# Altium project a0206-2006.PrjPcb (part 2 of 5)

## Sheet a0206-2006.6.SchDoc
size 558 x 431 mm
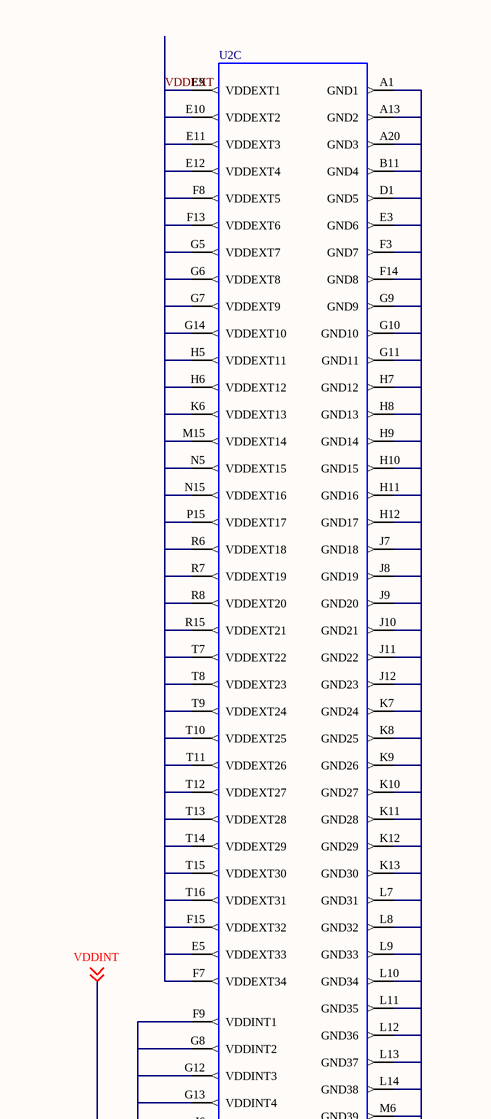
[diagram p15: a0206-2006.6.SchDoc, top left]
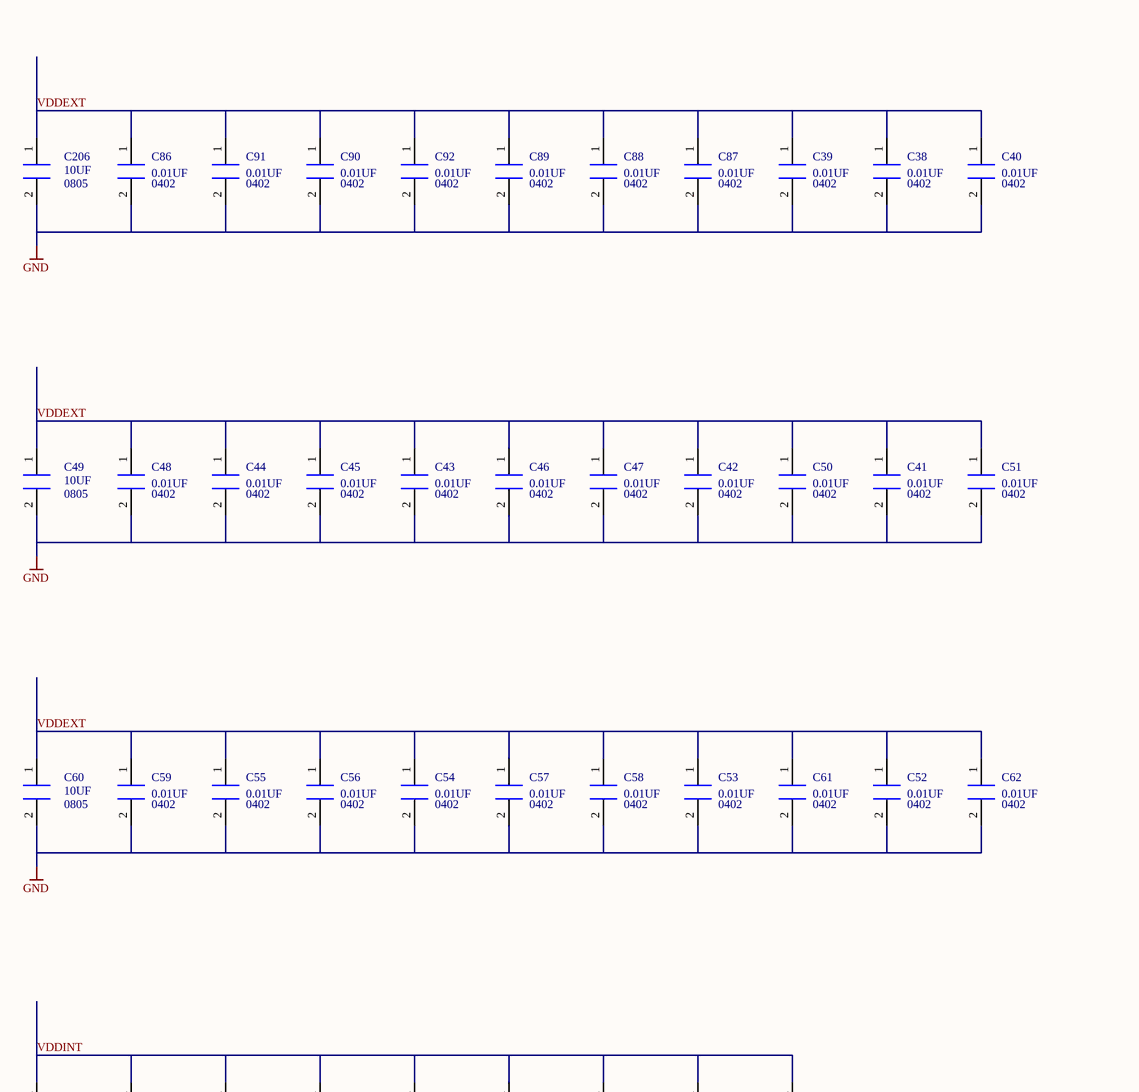
[diagram p16: a0206-2006.6.SchDoc, top right]
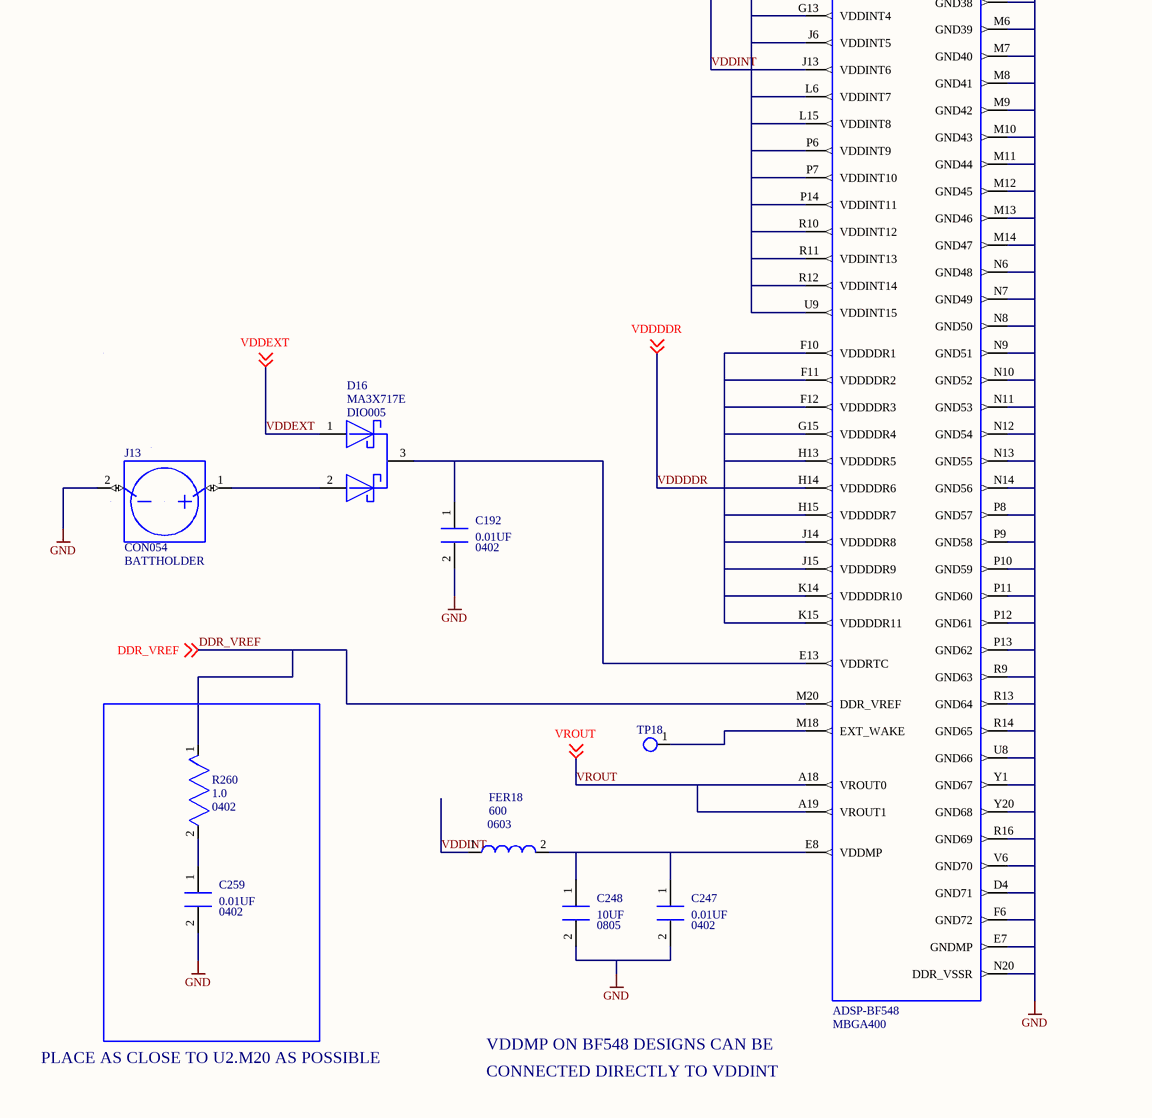
[diagram p17: a0206-2006.6.SchDoc, bottom left]
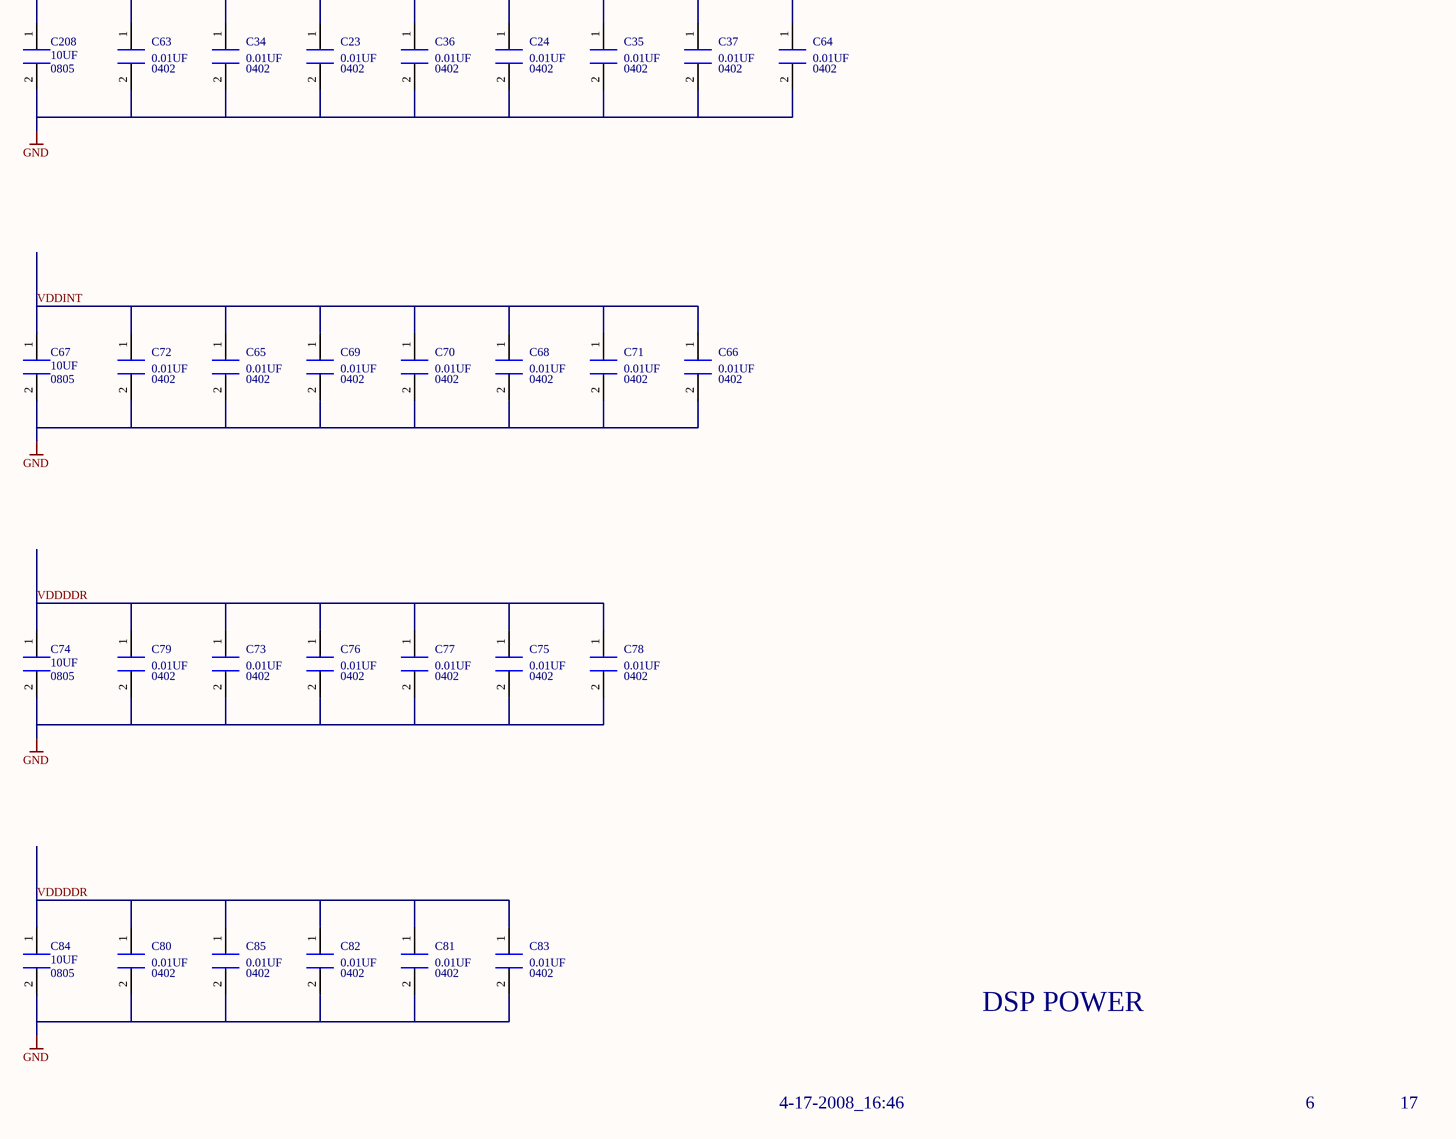
[diagram p18: a0206-2006.6.SchDoc, bottom right]

### Parts
C23  value 0.01UF  [0402]  (hidden comment: *)
C24  value 0.01UF  [0402]  (hidden comment: *)
C34  value 0.01UF  [0402]  (hidden comment: *)
C35  value 0.01UF  [0402]  (hidden comment: *)
C36  value 0.01UF  [0402]  (hidden comment: *)
C37  value 0.01UF  [0402]  (hidden comment: *)
C38  value 0.01UF  [0402]  (hidden comment: *)
C39  value 0.01UF  [0402]  (hidden comment: *)
C40  value 0.01UF  [0402]  (hidden comment: *)
C41  value 0.01UF  [0402]  (hidden comment: *)
C42  value 0.01UF  [0402]  (hidden comment: *)
C43  value 0.01UF  [0402]  (hidden comment: *)
C44  value 0.01UF  [0402]  (hidden comment: *)
C45  value 0.01UF  [0402]  (hidden comment: *)
C46  value 0.01UF  [0402]  (hidden comment: *)
C47  value 0.01UF  [0402]  (hidden comment: *)
C48  value 0.01UF  [0402]  (hidden comment: *)
C49  value 10UF  [0805]  (hidden comment: *)
C50  value 0.01UF  [0402]  (hidden comment: *)
C51  value 0.01UF  [0402]  (hidden comment: *)
C52  value 0.01UF  [0402]  (hidden comment: *)
C53  value 0.01UF  [0402]  (hidden comment: *)
C54  value 0.01UF  [0402]  (hidden comment: *)
C55  value 0.01UF  [0402]  (hidden comment: *)
C56  value 0.01UF  [0402]  (hidden comment: *)
C57  value 0.01UF  [0402]  (hidden comment: *)
C58  value 0.01UF  [0402]  (hidden comment: *)
C59  value 0.01UF  [0402]  (hidden comment: *)
C60  value 10UF  [0805]  (hidden comment: *)
C61  value 0.01UF  [0402]  (hidden comment: *)
C62  value 0.01UF  [0402]  (hidden comment: *)
C63  value 0.01UF  [0402]  (hidden comment: *)
C64  value 0.01UF  [0402]  (hidden comment: *)
C65  value 0.01UF  [0402]  (hidden comment: *)
C66  value 0.01UF  [0402]  (hidden comment: *)
C67  value 10UF  [0805]  (hidden comment: *)
C68  value 0.01UF  [0402]  (hidden comment: *)
C69  value 0.01UF  [0402]  (hidden comment: *)
C70  value 0.01UF  [0402]  (hidden comment: *)
C71  value 0.01UF  [0402]  (hidden comment: *)
C72  value 0.01UF  [0402]  (hidden comment: *)
C73  value 0.01UF  [0402]  (hidden comment: *)
C74  value 10UF  [0805]  (hidden comment: *)
C75  value 0.01UF  [0402]  (hidden comment: *)
C76  value 0.01UF  [0402]  (hidden comment: *)
C77  value 0.01UF  [0402]  (hidden comment: *)
C78  value 0.01UF  [0402]  (hidden comment: *)
C79  value 0.01UF  [0402]  (hidden comment: *)
C80  value 0.01UF  [0402]  (hidden comment: *)
C81  value 0.01UF  [0402]  (hidden comment: *)
C82  value 0.01UF  [0402]  (hidden comment: *)
C83  value 0.01UF  [0402]  (hidden comment: *)
C84  value 10UF  [0805]  (hidden comment: *)
C85  value 0.01UF  [0402]  (hidden comment: *)
C86  value 0.01UF  [0402]  (hidden comment: *)
C87  value 0.01UF  [0402]  (hidden comment: *)
C88  value 0.01UF  [0402]  (hidden comment: *)
C89  value 0.01UF  [0402]  (hidden comment: *)
C90  value 0.01UF  [0402]  (hidden comment: *)
C91  value 0.01UF  [0402]  (hidden comment: *)
C92  value 0.01UF  [0402]  (hidden comment: *)
C192  value 0.01UF  [0402]  (hidden comment: *)
C206  value 10UF  [0805]  (hidden comment: *)
C208  value 10UF  [0805]  (hidden comment: *)
C247  value 0.01UF  [0402]  (hidden comment: *)
C248  value 10UF  [0805]  (hidden comment: *)
C259  value 0.01UF  [0402]  (hidden comment: *)
D16  PART: MA3X717E  [DIO005]  (hidden comment: *)
FER18  value 600  [0603]  (hidden comment: *)
J13  BATTHOLDER  [CON054]
R260  value 1.0  [0402]  (hidden comment: *)
TP18  *  [TP]  (value not drawn)
U2  PART: ADSP-BF548  PKG_TYPE: MBGA400  (hidden comment: ICS_ADSPBF548)  (part C of 7)

### Nets
GND: C23.2(B) C24.2(B) C34.2(B) C35.2(B) C36.2(B) C37.2(B) C38.2(B) C39.2(B) C40.2(B) C41.2(B) C42.2(B) C43.2(B) C44.2(B) C45.2(B) C46.2(B) C47.2(B) C48.2(B) C49.2(B) C50.2(B) C51.2(B) C52.2(B) C53.2(B) C54.2(B) C55.2(B) C56.2(B) C57.2(B) C58.2(B) C59.2(B) C60.2(B) C61.2(B) C62.2(B) C63.2(B) C64.2(B) C65.2(B) C66.2(B) C67.2(B) C68.2(B) C69.2(B) C70.2(B) C71.2(B) C72.2(B) C73.2(B) C74.2(B) C75.2(B) C76.2(B) C77.2(B) C78.2(B) C79.2(B) C80.2(B) C81.2(B) C82.2(B) C83.2(B) C84.2(B) C85.2(B) C86.2(B) C87.2(B) C88.2(B) C89.2(B) C90.2(B) C91.2(B) C92.2(B) C192.2(B) C206.2(B) C208.2(B) C247.2(B) C248.2(B) C259.2(B) J13.2(NEG) U2.A1(GND1) U2.A13(GND2) U2.A20(GND3) U2.B11(GND4) U2.D1(GND5) U2.D4(GND71) U2.E3(GND6) U2.E7(GNDMP) U2.F3(GND7) U2.F6(GND72) U2.F14(GND8) U2.G9(GND9) U2.G10(GND10) U2.G11(GND11) U2.H7(GND12) U2.H8(GND13) U2.H9(GND14) U2.H10(GND15) U2.H11(GND16) U2.H12(GND17) U2.J7(GND18) U2.J8(GND19) U2.J9(GND20) U2.J10(GND21) U2.J11(GND22) U2.J12(GND23) U2.K7(GND24) U2.K8(GND25) U2.K9(GND26) U2.K10(GND27) U2.K11(GND28) U2.K12(GND29) U2.K13(GND30) U2.L7(GND31) U2.L8(GND32) U2.L9(GND33) U2.L10(GND34) U2.L11(GND35) U2.L12(GND36) U2.L13(GND37) U2.L14(GND38) U2.M6(GND39) U2.M7(GND40) U2.M8(GND41) U2.M9(GND42) U2.M10(GND43) U2.M11(GND44) U2.M12(GND45) U2.M13(GND46) U2.M14(GND47) U2.N6(GND48) U2.N7(GND49) U2.N8(GND50) U2.N9(GND51) U2.N10(GND52) U2.N11(GND53) U2.N12(GND54) U2.N13(GND55) U2.N14(GND56) U2.N20(DDR_VSSR) U2.P8(GND57) U2.P9(GND58) U2.P10(GND59) U2.P11(GND60) U2.P12(GND61) U2.P13(GND62) U2.R9(GND63) U2.R13(GND64) U2.R14(GND65) U2.R16(GND69) U2.U8(GND66) U2.V6(GND70) U2.Y1(GND67) U2.Y20(GND68)
DDR_VREF: R260.1(N1) U2.M20(DDR_VREF) ; off-sheet DDR_VREF
VDDDDR: C73.1(A) C74.1(A) C75.1(A) C76.1(A) C77.1(A) C78.1(A) C79.1(A) C80.1(A) C81.1(A) C82.1(A) C83.1(A) C84.1(A) C85.1(A) U2.F10(VDDDDR1) U2.F11(VDDDDR2) U2.F12(VDDDDR3) U2.G15(VDDDDR4) U2.H13(VDDDDR5) U2.H14(VDDDDR6) U2.H15(VDDDDR7) U2.J14(VDDDDR8) U2.J15(VDDDDR9) U2.K14(VDDDDR10) U2.K15(VDDDDR11) ; off-sheet VDDDDR
VDDEXT: C38.1(A) C39.1(A) C40.1(A) C41.1(A) C42.1(A) C43.1(A) C44.1(A) C45.1(A) C46.1(A) C47.1(A) C48.1(A) C49.1(A) C50.1(A) C51.1(A) C52.1(A) C53.1(A) C54.1(A) C55.1(A) C56.1(A) C57.1(A) C58.1(A) C59.1(A) C60.1(A) C61.1(A) C62.1(A) C86.1(A) C87.1(A) C88.1(A) C89.1(A) C90.1(A) C91.1(A) C92.1(A) C206.1(A) D16.1 U2.E5(VDDEXT33) U2.E9(VDDEXT1) U2.E10(VDDEXT2) U2.E11(VDDEXT3) U2.E12(VDDEXT4) U2.F7(VDDEXT34) U2.F8(VDDEXT5) U2.F13(VDDEXT6) U2.F15(VDDEXT32) U2.G5(VDDEXT7) U2.G6(VDDEXT8) U2.G7(VDDEXT9) U2.G14(VDDEXT10) U2.H5(VDDEXT11) U2.H6(VDDEXT12) U2.K6(VDDEXT13) U2.M15(VDDEXT14) U2.N5(VDDEXT15) U2.N15(VDDEXT16) U2.P15(VDDEXT17) U2.R6(VDDEXT18) U2.R7(VDDEXT19) U2.R8(VDDEXT20) U2.R15(VDDEXT21) U2.T7(VDDEXT22) U2.T8(VDDEXT23) U2.T9(VDDEXT24) U2.T10(VDDEXT25) U2.T11(VDDEXT26) U2.T12(VDDEXT27) U2.T13(VDDEXT28) U2.T14(VDDEXT29) U2.T15(VDDEXT30) U2.T16(VDDEXT31) ; off-sheet VDDEXT
VDDINT: C23.1(A) C24.1(A) C34.1(A) C35.1(A) C36.1(A) C37.1(A) C63.1(A) C64.1(A) C65.1(A) C66.1(A) C67.1(A) C68.1(A) C69.1(A) C70.1(A) C71.1(A) C72.1(A) C208.1(A) FER18.1(A) U2.F9(VDDINT1) U2.G8(VDDINT2) U2.G12(VDDINT3) U2.G13(VDDINT4) U2.J6(VDDINT5) U2.J13(VDDINT6) U2.L6(VDDINT7) U2.L15(VDDINT8) U2.P6(VDDINT9) U2.P7(VDDINT10) U2.P14(VDDINT11) U2.R10(VDDINT12) U2.R11(VDDINT13) U2.R12(VDDINT14) U2.U9(VDDINT15) ; off-sheet VDDINT
VROUT: U2.A18(VROUT0) U2.A19(VROUT1) ; off-sheet VROUT
NetC192_1: C192.1(A) D16.3 U2.E13(VDDRTC)
NetC247_1: C247.1(A) C248.1(A) FER18.2(B) U2.E8(VDDMP)
NetC259_1: C259.1(A) R260.2(N2)
NetD16_2: D16.2 J13.1(POS)
NetTP18_1: TP18.1(TP) U2.M18(EXT_WAKE)

### Notes on the sheet
- DSP POWER
- PLACE AS CLOSE TO U2.M20 AS POSSIBLE
- CONNECTED DIRECTLY TO VDDINT
- VDDMP ON BF548 DESIGNS CAN BE
- 4-17-2008_16:46
- 6
- 17
- A
- B
- C
- D
- 1
- 2
- 3
- 20 Cotton Road
- 4
- DEVICES
- ANALOG
- Nashua, NH 03063
- PH: 1-800-ANALOGD
- Title
- ADSP-BF548 EZ-KIT LITE
- Size
- Board No.
- A0206-2006
- Rev
- 1.4B
- Date
- Sheet
- of

### Library data of the parts
C23 C24 C34 C37 C50 C54 C55 C58 C59 C72 C79 C82 C83 C85 C86 C88 C91 C92 C192 C247 = CAP_NON_POLARIZED.2: as C7 on sheet a0206-2006.2; PKG_TYPE: 0402; ROHS: ROHS
C35 C36 C40 C41 C53 C56 C57 C62 C81 C87 C89 C90 = CAP_NON_POLARIZED.2: PART_SPEC: CAPACITOR; LEVEL: STD; TYPE: X7R; BOARDS: BOTH; PRT_NUM: 7000279; VOLTAGE: 16V; TOLERANCE: 10%; PKG_TYPE: 0402; ROHS: ROHS
C38 C42 C45 C46 C51 C52 C70 C71 C77 C78 = CAP_NON_POLARIZED.2: PART_SPEC: CAPACITOR; LEVEL: STD; TOLERANCE: 10%; VOLTAGE: 16V; PRT_NUM: 7000279; BOARDS: BOTH; TYPE: X7R; PKG_TYPE: 0402; ROHS: ROHS
C39 C43 C44 C47 C48 C61 C63-C66 C68 C69 C73 C75 C76 C80 C259 = CAP_NON_POLARIZED.2: as C3 on sheet a0206-2006.2; PKG_TYPE: 0402; ROHS: ROHS
C49 C67 C74 = CAP_NON_POLARIZED.2: PART_SPEC: CAPACITOR; LEVEL: STD; BOARDS: BOTH; TOLERANCE: 10%; VOLTAGE: 6.3V; PRT_NUM: 7000265; TYPE: X5R; PKG_TYPE: 0805; ROHS: ROHS
C60 C84 C206 C208 = CAP_NON_POLARIZED.2: PART_SPEC: CAPACITOR; LEVEL: STD; TYPE: X5R; PRT_NUM: 7000265; VOLTAGE: 6.3V; TOLERANCE: 10%; BOARDS: BOTH; PKG_TYPE: 0805; ROHS: ROHS
C248 = CAP_NON_POLARIZED.2: PART_SPEC: CAPACITOR; LEVEL: STD; PRT_NUM: 7000265; VOLTAGE: 6.3V; TOLERANCE: 10%; BOARDS: BOTH; TYPE: X5R; PKG_TYPE: 0805; ROHS: ROHS
D16 = DIO_MA3X717E.1: SCHOTTKY BARRIER; LEVEL: STD; CURRENT: 20MA; PRT_NUM: 7000559; PKG_TYPE: DIO005; WEB: http://www.semicon.panasonic.co.jp/ds/eng/SKH00078CED.pdf; ROHS: ROHS
FER18 = FER_STANDARD.1: PART_SPEC: FERRITE; LEVEL: STD; PRT_NUM: 7000112; FREQ: 100MHZ; CURRENT: 200MA; PKG_TYPE: 0603; ROHS: ROHS
J13 = CON_BATTERYHOLDER.1: FOR 24MM COIN; LEVEL: STD; PRT_NUM: 6000829; PKG_TYPE: CON054; DEVICE: BATTHOLDER; TYPE: BATT_HOLDER; CONFIGURATION: 24MM; ROHS: ROHS
R260 = RES_STANDARD.2: PART_SPEC: RESISTOR; LEVEL: STD; TOLERANCE: 1%; PRT_NUM: 7000608; POWER: 1/16W; PKG_TYPE: 0402; ROHS: ROHS
TP18 = MSC_TEST_POINT.2: TESTPOINT; CLASS: DNP; LEVEL: STD; PART_SPEC: TESTPOINT; PART: TESTPOINT; ROHS: ROHS; PKG_TYPE: TP
U2 = ICS_ADSPBF548_A: as U2 on sheet a0206-2006.2; DEVICE: ICS_ADSPBF548; ROHS: ROHS; WEB: http://www.analog.com/en/prod/0,2877,ADSP%252DBF548,00.html

## Sheet a0206-2006.7.SchDoc
size 558 x 431 mm
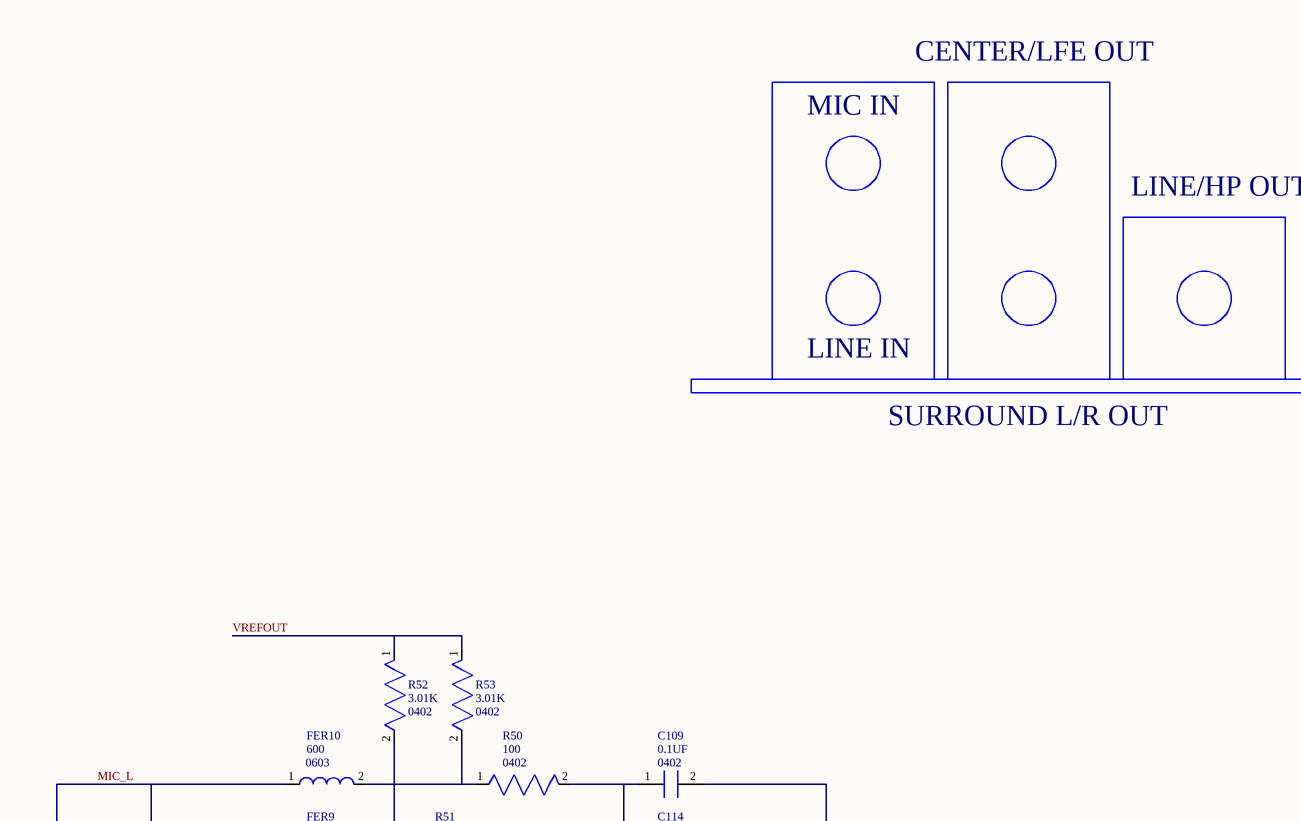
[diagram p19: a0206-2006.7.SchDoc, top left]
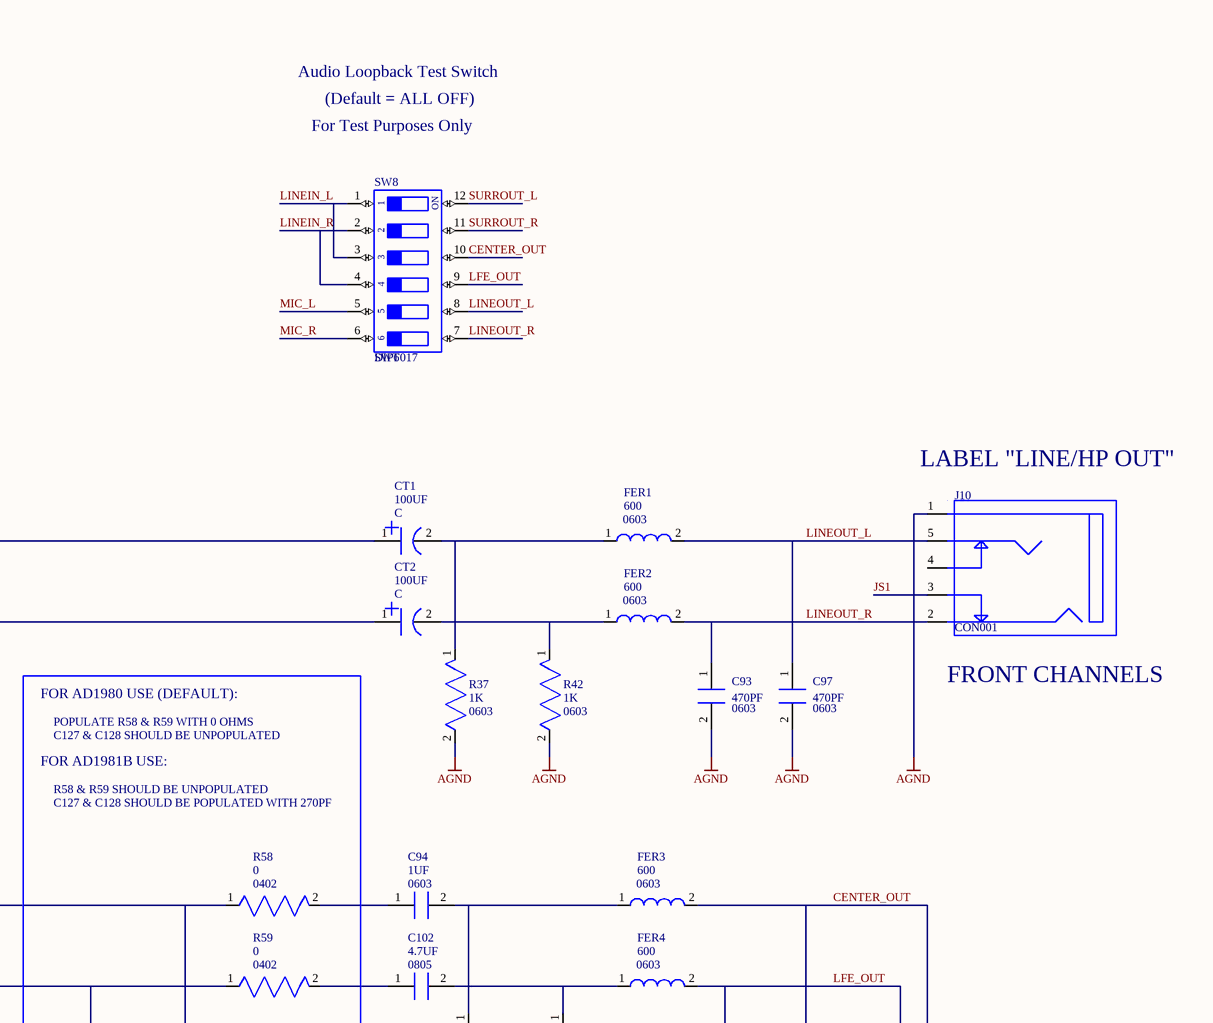
[diagram p20: a0206-2006.7.SchDoc, top right]
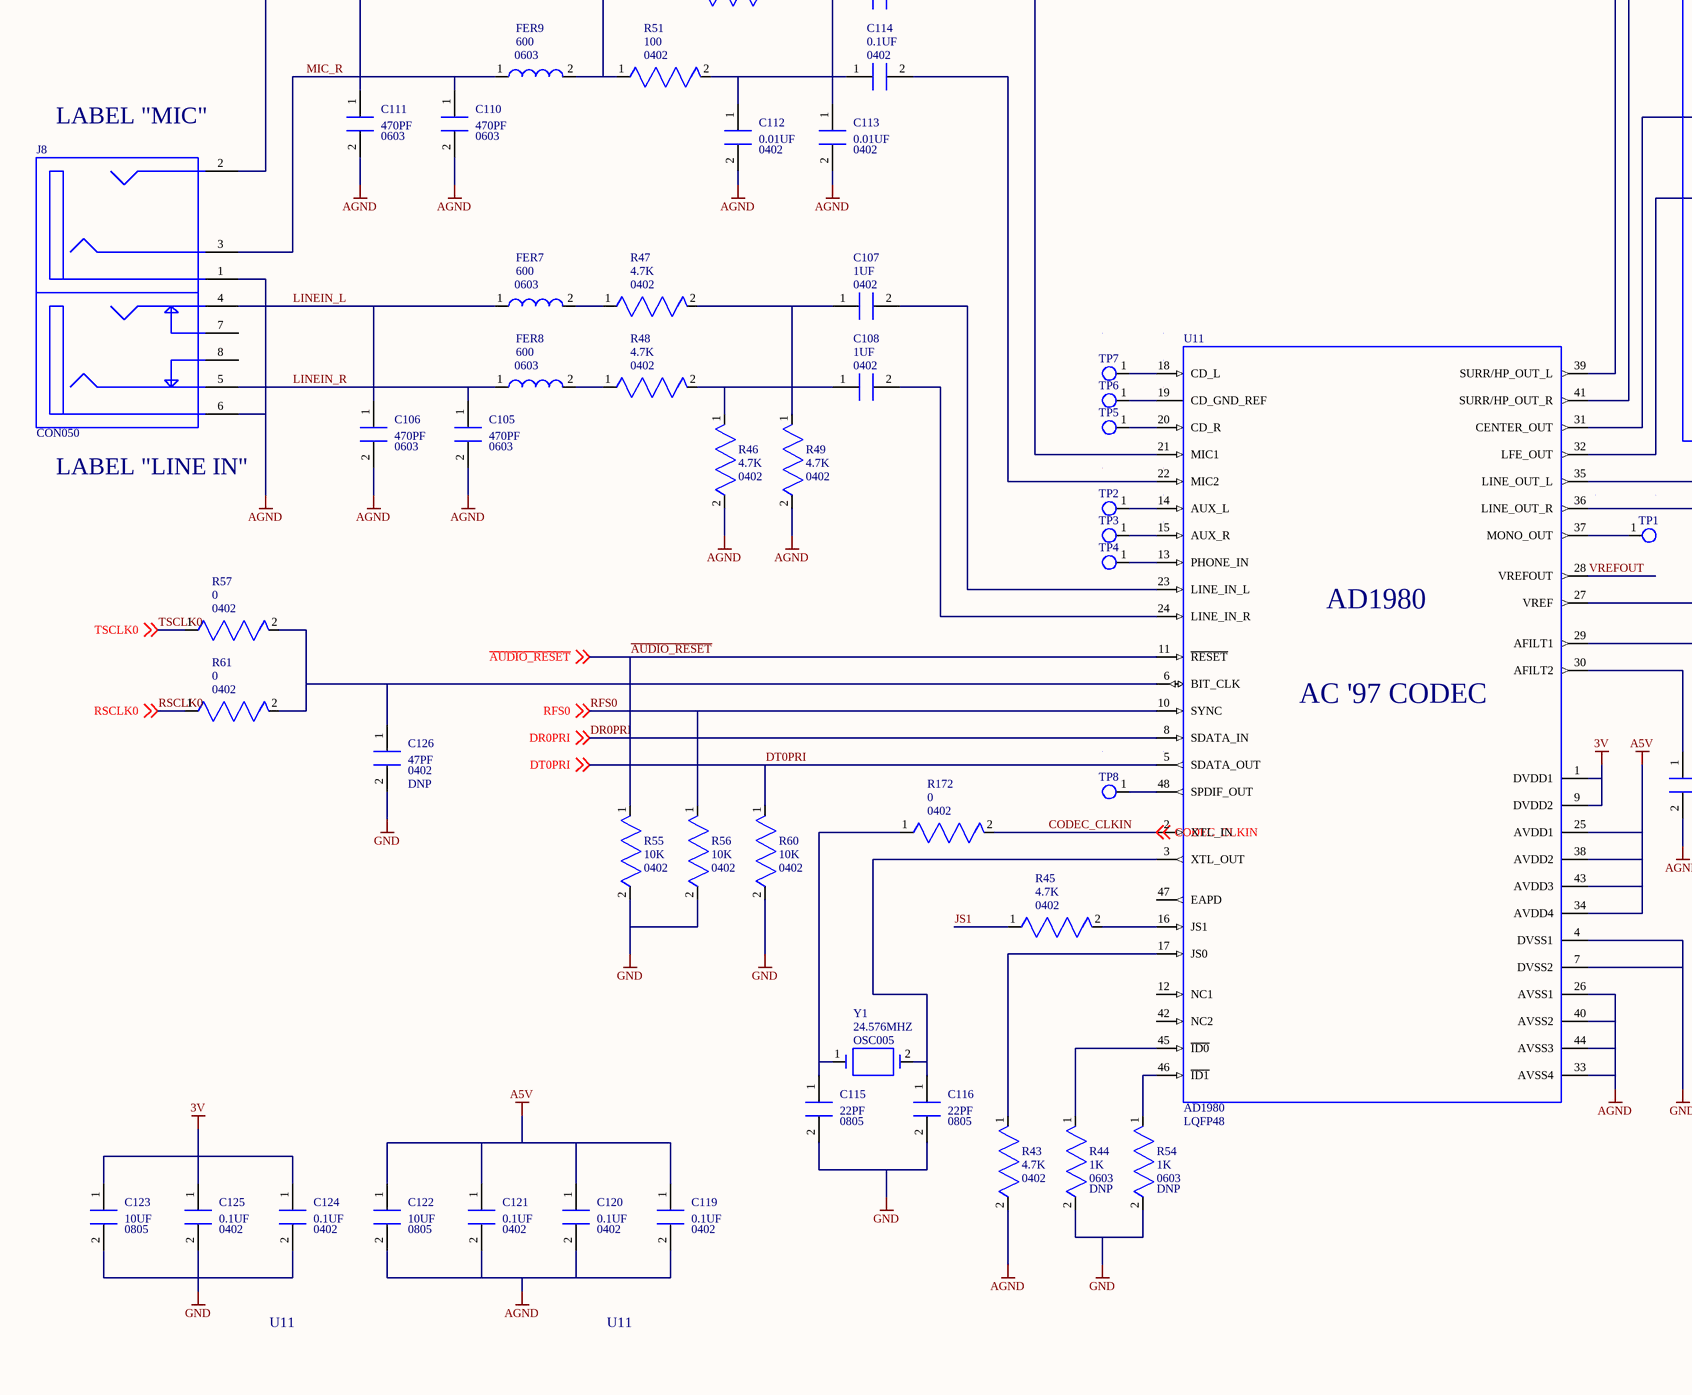
[diagram p21: a0206-2006.7.SchDoc, bottom left]
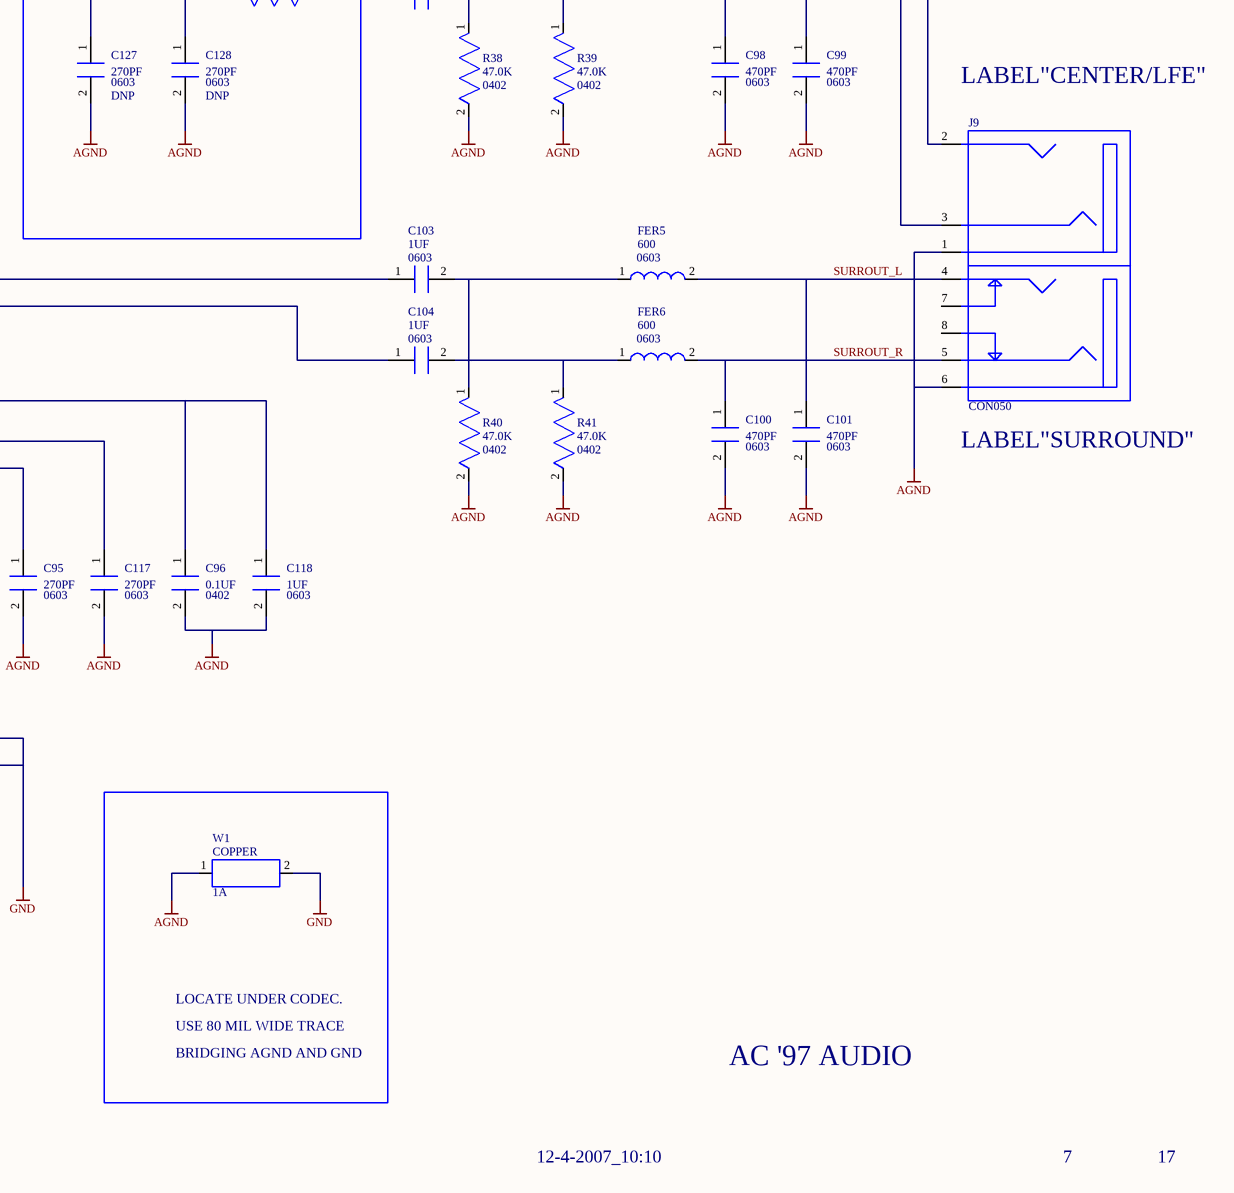
[diagram p22: a0206-2006.7.SchDoc, bottom right]

### Parts
C93  value 470PF  [0603]  (hidden comment: *)
C94  value 1UF  [0603]  (hidden comment: *)
C95  value 270PF  [0603]  (hidden comment: *)
C96  value 0.1UF  [0402]  (hidden comment: *)
C97  value 470PF  [0603]  (hidden comment: *)
C98  value 470PF  [0603]  (hidden comment: *)
C99  value 470PF  [0603]  (hidden comment: *)
C100  value 470PF  [0603]  (hidden comment: *)
C101  value 470PF  [0603]  (hidden comment: *)
C102  value 4.7UF  [0805]  (hidden comment: *)
C103  value 1UF  [0603]  (hidden comment: *)
C104  value 1UF  [0603]  (hidden comment: *)
C105  value 470PF  [0603]  (hidden comment: *)
C106  value 470PF  [0603]  (hidden comment: *)
C107  value 1UF  [0402]  (hidden comment: *)
C108  value 1UF  [0402]  (hidden comment: *)
C109  value 0.1UF  [0402]  (hidden comment: *)
C110  value 470PF  [0603]  (hidden comment: *)
C111  value 470PF  [0603]  (hidden comment: *)
C112  value 0.01UF  [0402]  (hidden comment: *)
C113  value 0.01UF  [0402]  (hidden comment: *)
C114  value 0.1UF  [0402]  (hidden comment: *)
C115  value 22PF  [0805]  (hidden comment: *)
C116  value 22PF  [0805]  (hidden comment: *)
C117  value 270PF  [0603]  (hidden comment: *)
C118  value 1UF  [0603]  (hidden comment: *)
C119  value 0.1UF  [0402]  (hidden comment: *)
C120  value 0.1UF  [0402]  (hidden comment: *)
C121  value 0.1UF  [0402]  (hidden comment: *)
C122  value 10UF  [0805]  (hidden comment: *)
C123  value 10UF  [0805]  (hidden comment: *)
C124  value 0.1UF  [0402]  (hidden comment: *)
C125  value 0.1UF  [0402]  (hidden comment: *)
C126  value 47PF  CLASS: DNP  [0402]  (hidden comment: *)
C127  value 270PF  CLASS: DNP  [0603]  (hidden comment: *)
C128  value 270PF  CLASS: DNP  [0603]  (hidden comment: *)
CT1  value 100UF  [C]  (hidden comment: *)
CT2  value 100UF  [C]  (hidden comment: *)
FER1  value 600  [0603]  (hidden comment: *)
FER2  value 600  [0603]  (hidden comment: *)
FER3  value 600  [0603]  (hidden comment: *)
FER4  value 600  [0603]  (hidden comment: *)
FER5  value 600  [0603]  (hidden comment: *)
FER6  value 600  [0603]  (hidden comment: *)
FER7  value 600  [0603]  (hidden comment: *)
FER8  value 600  [0603]  (hidden comment: *)
FER9  value 600  [0603]  (hidden comment: *)
FER10  value 600  [0603]  (hidden comment: *)
J8  *  [CON050]  (value not drawn)
J9  *  [CON050]  (value not drawn)
J10  *  [CON001]  (value not drawn)
R37  value 1K  [0603]  (hidden comment: *)
R38  value 47.0K  [0402]  (hidden comment: *)
R39  value 47.0K  [0402]  (hidden comment: *)
R40  value 47.0K  [0402]  (hidden comment: *)
R41  value 47.0K  [0402]  (hidden comment: *)
R42  value 1K  [0603]  (hidden comment: *)
R43  value 4.7K  [0402]  (hidden comment: *)
R44  value 1K  CLASS: DNP  [0603]  (hidden comment: *)
R45  value 4.7K  [0402]  (hidden comment: *)
R46  value 4.7K  [0402]  (hidden comment: *)
R47  value 4.7K  [0402]  (hidden comment: *)
R48  value 4.7K  [0402]  (hidden comment: *)
R49  value 4.7K  [0402]  (hidden comment: *)
R50  value 100  [0402]  (hidden comment: *)
R51  value 100  [0402]  (hidden comment: *)
R52  value 3.01K  [0402]  (hidden comment: *)
R53  value 3.01K  [0402]  (hidden comment: *)
R54  value 1K  CLASS: DNP  [0603]  (hidden comment: *)
R55  value 10K  [0402]  (hidden comment: *)
R56  value 10K  [0402]  (hidden comment: *)
R57  value 0  [0402]  (hidden comment: *)
R58  value 0  [0402]  (hidden comment: *)
R59  value 0  [0402]  (hidden comment: *)
R60  value 10K  [0402]  (hidden comment: *)
R61  value 0  [0402]  (hidden comment: *)
R172  value 0  [0402]  (hidden comment: *)
SW8  value DIP6  [SWT017]  (hidden comment: *)
TP1  *  [TP]  (value not drawn)
TP2  *  [TP]  (value not drawn)
TP3  *  [TP]  (value not drawn)
TP4  *  [TP]  (value not drawn)
TP5  *  [TP]  (value not drawn)
TP6  *  [TP]  (value not drawn)
TP7  *  [TP]  (value not drawn)
TP8  *  [TP]  (value not drawn)
U11  PART: AD1980  [LQFP48]  (hidden comment: *)
W1  value COPPER  [1A]  (hidden comment: *)
Y1  value 24.576MHZ  [OSC005]  (hidden comment: *)

### Nets
3V: C123.1(A) C124.1(A) C125.1(A) U11.1(DVDD1) U11.9(DVDD2)
A5V: C119.1(A) C120.1(A) C121.1(A) C122.1(A) U11.25(AVDD1) U11.34(AVDD4) U11.38(AVDD2) U11.43(AVDD3)
AGND: C93.2(B) C95.2(B) C96.2(B) C97.2(B) C98.2(B) C99.2(B) C100.2(B) C101.2(B) C105.2(B) C106.2(B) C110.2(B) C111.2(B) C112.2(B) C113.2(B) C117.2(B) C118.2(B) C119.2(B) C120.2(B) C121.2(B) C122.2(B) C127.2(B) C128.2(B) J8.1 J8.6 J9.1 J9.6 J10.1 R37.2(N2) R38.2(N2) R39.2(N2) R40.2(N2) R41.2(N2) R42.2(N2) R43.2(N2) R46.2(N2) R49.2(N2) U11.26(AVSS1) U11.33(AVSS4) U11.40(AVSS2) U11.44(AVSS3) W1.1(N1)
GND: C115.2(B) C116.2(B) C123.2(B) C124.2(B) C125.2(B) C126.2(B) R44.2(N2) R54.2(N2) R55.2(N2) R56.2(N2) R60.2(N2) U11.4(DVSS1) U11.7(DVSS2) W1.2(N2)
~{AUDIO_RESET}: R55.1(N1) U11.11(~{RESET}) ; off-sheet ~{AUDIO_RESET}
CENTER_OUT: C99.1(A) FER3.2(B) J9.2 SW8.10
CODEC_CLKIN: R172.2(N2) U11.2(XTL_IN) ; off-sheet CODEC_CLKIN
DR0PRI: U11.8(SDATA_IN) ; off-sheet DR0PRI
DT0PRI: R60.1(N1) U11.5(SDATA_OUT) ; off-sheet DT0PRI
JS1: J10.3 R45.1(N1)
LFE_OUT: C98.1(A) FER4.2(B) J9.3 SW8.9
LINEIN_L: C106.1(A) FER7.1(A) J8.4 SW8.1 SW8.3
LINEIN_R: C105.1(A) FER8.1(A) J8.5 SW8.2 SW8.4
LINEOUT_L: C97.1(A) FER1.2(B) J10.5 SW8.8
LINEOUT_R: C93.1(A) FER2.2(B) J10.2 SW8.7
MIC_L: C111.1(A) FER10.1(A) J8.2 SW8.5
MIC_R: C110.1(A) FER9.1(A) J8.3 SW8.6
RFS0: R56.1(N1) U11.10(SYNC) ; off-sheet RFS0
RSCLK0: R61.1(N1) ; off-sheet RSCLK0
SURROUT_L: C101.1(A) FER5.2(B) J9.4 SW8.12
SURROUT_R: C100.1(A) FER6.2(B) J9.5 SW8.11
TSCLK0: R57.1(N1) ; off-sheet TSCLK0
VREFOUT: R52.1(N1) R53.1(N1) U11.28(VREFOUT)
NetC94_1: C94.1(A) R58.2(N2)
NetC94_2: C94.2(B) FER3.1(A) R38.1(N1)
NetC95_1: C95.1(A) U11.30(AFILT2)
NetC96_1: C96.1(A) C118.1(A) U11.27(VREF)
NetC102_1: C102.1(A) R59.2(N2)
NetC102_2: C102.2(B) FER4.1(A) R39.1(N1)
NetC103_1: C103.1(A) U11.35(LINE_OUT_L)
NetC103_2: C103.2(B) FER5.1(A) R40.1(N1)
NetC104_1: C104.1(A) U11.36(LINE_OUT_R)
NetC104_2: C104.2(B) FER6.1(A) R41.1(N1)
NetC107_1: C107.1(A) R47.2(N2) R49.1(N1)
NetC107_2: C107.2(B) U11.23(LINE_IN_L)
NetC108_1: C108.1(A) R46.1(N1) R48.2(N2)
NetC108_2: C108.2(B) U11.24(LINE_IN_R)
NetC109_1: C109.1(A) C113.1(A) R50.2(N2)
NetC109_2: C109.2(B) U11.21(MIC1)
NetC112_1: C112.1(A) C114.1(A) R51.2(N2)
NetC114_2: C114.2(B) U11.22(MIC2)
NetC115_1: C115.1(A) R172.1(N1) Y1.1(N1)
NetC116_1: C116.1(A) U11.3(XTL_OUT) Y1.2(N2)
NetC117_1: C117.1(A) U11.29(AFILT1)
NetC126_1: C126.1(A) R57.2(N2) R61.2(N2) U11.6(BIT_CLK)
NetC127_1: C127.1(A) R59.1(N1) U11.32(LFE_OUT)
NetC128_1: C128.1(A) R58.1(N1) U11.31(CENTER_OUT)
NetCT1_1: CT1.1(P) U11.39(SURR/HP_OUT_L)
NetCT1_2: CT1.2(N) FER1.1(A) R37.1(N1)
NetCT2_1: CT2.1(P) U11.41(SURR/HP_OUT_R)
NetCT2_2: CT2.2(N) FER2.1(A) R42.1(N1)
NetFER7_2: FER7.2(B) R47.1(N1)
NetFER8_2: FER8.2(B) R48.1(N1)
NetFER9_2: FER9.2(B) R51.1(N1) R52.2(N2)
NetFER10_2: FER10.2(B) R50.1(N1) R53.2(N2)
NetR43_1: R43.1(N1) U11.17(JS0)
NetR44_1: R44.1(N1) U11.45(~{ID0})
NetR45_2: R45.2(N2) U11.16(JS1)
NetR54_1: R54.1(N1) U11.46(~{ID1})
NetTP1_1: TP1.1(TP) U11.37(MONO_OUT)
NetTP2_1: TP2.1(TP) U11.14(AUX_L)
NetTP3_1: TP3.1(TP) U11.15(AUX_R)
NetTP4_1: TP4.1(TP) U11.13(PHONE_IN)
NetTP5_1: TP5.1(TP) U11.20(CD_R)
NetTP6_1: TP6.1(TP) U11.19(CD_GND_REF)
NetTP7_1: TP7.1(TP) U11.18(CD_L)
NetTP8_1: TP8.1(TP) U11.48(SPDIF_OUT)

Not connected (* = marked no-connect by the designer): J8 7 8; J9 7 8; J10 4; U11 12(NC1) 42(NC2) 47(EAPD)

### Notes on the sheet
- CENTER/LFE OUT
- Audio Loopback Test Switch
- MIC IN
- For Test Purposes Only
- (Default = ALL OFF)
- LINE/HP OUT
- LINE IN
- SURROUND L/R OUT
- (near J10) LABEL "LINE/HP OUT"
- (near J10) FRONT CHANNELS
- FOR AD1980 USE (DEFAULT):
- POPULATE R58 & R59 WITH 0 OHMS
- C127 & C128 SHOULD BE UNPOPULATED
- FOR AD1981B USE:
- R58 & R59 SHOULD BE UNPOPULATED
- C127 & C128 SHOULD BE POPULATED WITH 270PF
- (near J8) LABEL "MIC"
- LABEL"CENTER/LFE"
- (near J8) LABEL "LINE IN"
- (near J9) LABEL"SURROUND"
- LOCATE UNDER CODEC.
- USE 80 MIL WIDE TRACE
- BRIDGING AGND AND GND
- AC '97 AUDIO
- U11
- 12-4-2007_10:10
- 7
- 17
- A
- B
- C
- D
- 1
- 2
- 3
- 20 Cotton Road
- 4
- DEVICES
- ANALOG
- Nashua, NH 03063
- PH: 1-800-ANALOGD
- Title
- ADSP-BF548 EZ-KIT LITE
- Size
- Board No.
- A0206-2006
- Rev
- 1.4B
- Date
- Sheet
- of
- (in symbol ICS_AD1980.1) AC '97 CODEC
- (in symbol SW_DIP6.1) ON

### Library data of the parts
C93 C99 C101 C106 C110 = CAP_NON_POLARIZED.2: PART_SPEC: CAPACITOR; LEVEL: STD; PRT_NUM: 7000352; TYPE: NPO; VOLTAGE: 50V; TOLERANCE: 5%; PKG_TYPE: 0603; ROHS: ROHS
C94 C103 = CAP_NON_POLARIZED.1: PART_SPEC: CAPACITOR; LEVEL: STD; PRT_NUM: 7000344; TYPE: X5R; VOLTAGE: 16V; TOLERANCE: 10%; PKG_TYPE: 0603; ROHS: ROHS
C95 C128 = CAP_NON_POLARIZED.2: PART_SPEC: CAPACITOR; LEVEL: STD; PRT_NUM: 7000419; TYPE: CERM; VOLTAGE: 50V; TOLERANCE: 5%; PKG_TYPE: 0603; ROHS: ROHS
C96 C120 = CAP_NON_POLARIZED.2: PART_SPEC: CAPACITOR; LEVEL: STD; PRT_NUM: 7000278; TYPE: X5R; VOLTAGE: 10V; TOLERANCE: 10%; PKG_TYPE: 0402; ROHS: ROHS
C97 C98 C100 C105 C111 = CAP_NON_POLARIZED.2: PART_SPEC: CAPACITOR; LEVEL: STD; TOLERANCE: 5%; VOLTAGE: 50V; TYPE: NPO; PRT_NUM: 7000352; PKG_TYPE: 0603; ROHS: ROHS
C102 = CAP_NON_POLARIZED.1: PART_SPEC: CAPACITOR; LEVEL: STD; TOLERANCE: 20%; VOLTAGE: 25V; TYPE: X5R; PRT_NUM: 7000347; PKG_TYPE: 0805; ROHS: ROHS
C104 = CAP_NON_POLARIZED.1: PART_SPEC: CAPACITOR; LEVEL: STD; TOLERANCE: 10%; VOLTAGE: 16V; TYPE: X5R; PRT_NUM: 7000344; PKG_TYPE: 0603; ROHS: ROHS
C107 = CAP_NON_POLARIZED.1: PART_SPEC: CAPACITOR; LEVEL: STD; TOLERANCE: 20%; VOLTAGE: 6.3V; TYPE: X7R; PRT_NUM: 7000431; PKG_TYPE: 0402; ROHS: ROHS
C108 = CAP_NON_POLARIZED.1: PART_SPEC: CAPACITOR; LEVEL: STD; PRT_NUM: 7000431; TYPE: X7R; VOLTAGE: 6.3V; TOLERANCE: 20%; PKG_TYPE: 0402; ROHS: ROHS
C109 = CAP_NON_POLARIZED.1: PART_SPEC: CAPACITOR; LEVEL: STD; PRT_NUM: 7000278; TYPE: X5R; VOLTAGE: 10V; TOLERANCE: 10%; PKG_TYPE: 0402; ROHS: ROHS
C112 = CAP_NON_POLARIZED.2: PART_SPEC: CAPACITOR; LEVEL: STD; TOLERANCE: 10%; VOLTAGE: 16V; TYPE: X7R; PRT_NUM: 7000279; PKG_TYPE: 0402; ROHS: ROHS
C113 = CAP_NON_POLARIZED.2: PART_SPEC: CAPACITOR; LEVEL: STD; PRT_NUM: 7000279; TYPE: X7R; VOLTAGE: 16V; TOLERANCE: 10%; PKG_TYPE: 0402; ROHS: ROHS
C114 = CAP_NON_POLARIZED.1: PART_SPEC: CAPACITOR; LEVEL: STD; TOLERANCE: 10%; VOLTAGE: 10V; TYPE: X5R; PRT_NUM: 7000278; PKG_TYPE: 0402; ROHS: ROHS
C115 = CAP_NON_POLARIZED.2: PART_SPEC: CAPACITOR; LEVEL: STD; PRT_NUM: 7000028; TYPE: NPO; VOLTAGE: 50V; TOLERANCE: 5%; PKG_TYPE: 0805; ROHS: ROHS
C116 = CAP_NON_POLARIZED.2: PART_SPEC: CAPACITOR; LEVEL: STD; TOLERANCE: 5%; VOLTAGE: 50V; TYPE: NPO; PRT_NUM: 7000028; PKG_TYPE: 0805; ROHS: ROHS
C117 C127 = CAP_NON_POLARIZED.2: PART_SPEC: CAPACITOR; LEVEL: STD; TOLERANCE: 5%; VOLTAGE: 50V; TYPE: CERM; PRT_NUM: 7000419; PKG_TYPE: 0603; ROHS: ROHS
C118 = CAP_NON_POLARIZED.2: PART_SPEC: CAPACITOR; LEVEL: STD; TOLERANCE: 10%; VOLTAGE: 16V; TYPE: X5R; PRT_NUM: 7000344; PKG_TYPE: 0603; ROHS: ROHS
C119 C121 C124 C125 = CAP_NON_POLARIZED.2: PART_SPEC: CAPACITOR; LEVEL: STD; TOLERANCE: 10%; VOLTAGE: 10V; TYPE: X5R; PRT_NUM: 7000278; PKG_TYPE: 0402; ROHS: ROHS
C122 C123 = CAP_NON_POLARIZED.2: PART_SPEC: CAPACITOR; LEVEL: STD; PRT_NUM: 7000265; TYPE: X5R; VOLTAGE: 6.3V; TOLERANCE: 10%; PKG_TYPE: 0805; ROHS: ROHS
C126 = CAP_NON_POLARIZED.2: PART_SPEC: CAPACITOR; LEVEL: STD; TOLERANCE: 10%; VOLTAGE: 10V; TYPE: X5R; PKG_TYPE: 0402; ROHS: ROHS
CT1 CT2 = CAP_POLARIZED.1: PART_SPEC: CAPACITOR; LEVEL: STD; PRT_NUM: 7000303; VOLTAGE: 10V; TOLERANCE: 10%; PKG_TYPE: C; TYPE: TANT-LOW-ESR; ROHS: ROHS
FER1 FER3 FER5 FER8 FER10 = FER_STANDARD.1: PART_SPEC: FERRITE; LEVEL: STD; PRT_NUM: 7000112; FREQ: 100MHZ; CURRENT: 200MA; PKG_TYPE: 0603; ROHS: ROHS
FER2 FER4 FER6 FER7 FER9 = FER_STANDARD.1: PART_SPEC: FERRITE; LEVEL: STD; CURRENT: 200MA; FREQ: 100MHZ; PRT_NUM: 7000112; PKG_TYPE: 0603; ROHS: ROHS
J8 = CON_STEREOJACK_DUAL.2: AUDIO; PART_SPEC: CONNECTOR; LEVEL: STD; PRT_NUM: 6000825; CONFIGURATION: DUAL_STEREO; PKG_TYPE: CON050; TYPE: 3.5MM; ROHS: ROHS
J9 = CON_STEREOJACK_DUAL.1: AUDIO; PART_SPEC: CONNECTOR; LEVEL: STD; PRT_NUM: 6000825; CONFIGURATION: DUAL_STEREO; PKG_TYPE: CON050; TYPE: 3.5MM; ROHS: ROHS
J10 = CON_STEREOJACK.3: REPLACES ST-323-5; PART_SPEC: CONNECTOR; LEVEL: STD; PRT_NUM: 6000798; CONFIGURATION: STEREO_JACK; PKG_TYPE: CON001; TYPE: 3.5MM; ROHS: ROHS
R37 R44 = RES_STANDARD.2: PART_SPEC: RESISTOR; LEVEL: STD; PRT_NUM: 7000384; POWER: 1/10W; TOLERANCE: 5%; PKG_TYPE: 0603; ROHS: ROHS
R38-R41 = RES_STANDARD.2: PART_SPEC: RESISTOR; LEVEL: STD; PRT_NUM: 7000567; POWER: 1/16W; TOLERANCE: 1%; PKG_TYPE: 0402; ROHS: ROHS
R42 R54 = RES_STANDARD.2: PART_SPEC: RESISTOR; LEVEL: STD; TOLERANCE: 5%; POWER: 1/10W; PRT_NUM: 7000384; PKG_TYPE: 0603; ROHS: ROHS
R43 R49 = RES_STANDARD.2: PART_SPEC: RESISTOR; LEVEL: STD; TOLERANCE: 5%; POWER: 1/16W; PRT_NUM: 7000281; PKG_TYPE: 0402; ROHS: ROHS
R45 R47 = RES_STANDARD.1: PART_SPEC: RESISTOR; LEVEL: STD; PRT_NUM: 7000281; POWER: 1/16W; TOLERANCE: 5%; PKG_TYPE: 0402; ROHS: ROHS
R46 = RES_STANDARD.2: PART_SPEC: RESISTOR; LEVEL: STD; PRT_NUM: 7000281; POWER: 1/16W; TOLERANCE: 5%; PKG_TYPE: 0402; ROHS: ROHS
R48 = RES_STANDARD.1: PART_SPEC: RESISTOR; LEVEL: STD; TOLERANCE: 5%; POWER: 1/16W; PRT_NUM: 7000281; PKG_TYPE: 0402; ROHS: ROHS
R50 = RES_STANDARD.1: PART_SPEC: RESISTOR; LEVEL: STD; TOLERANCE: 5%; POWER: 1/16W; PRT_NUM: 7000432; PKG_TYPE: 0402; ROHS: ROHS
R51 = RES_STANDARD.1: PART_SPEC: RESISTOR; LEVEL: STD; PRT_NUM: 7000432; POWER: 1/16W; TOLERANCE: 5%; PKG_TYPE: 0402; ROHS: ROHS
R52 = RES_STANDARD.2: PART_SPEC: RESISTOR; LEVEL: STD; PRT_NUM: 7000568; POWER: 1/16W; TOLERANCE: 1%; PKG_TYPE: 0402; ROHS: ROHS
R53 = RES_STANDARD.2: PART_SPEC: RESISTOR; LEVEL: STD; TOLERANCE: 1%; POWER: 1/16W; PRT_NUM: 7000568; PKG_TYPE: 0402; ROHS: ROHS
R55 R60 = RES_STANDARD.2: PART_SPEC: RESISTOR; LEVEL: STD; TOLERANCE: 5%; POWER: 1/16W; PRT_NUM: 7000280; PKG_TYPE: 0402; ROHS: ROHS
R56 = RES_STANDARD.2: PART_SPEC: RESISTOR; LEVEL: STD; PRT_NUM: 7000280; POWER: 1/16W; TOLERANCE: 5%; PKG_TYPE: 0402; ROHS: ROHS
R57 = RES_STANDARD.1: PART_SPEC: RESISTOR; LEVEL: STD; PRT_NUM: 7000282; TOLERANCE: 5%; POWER: 1/16W; PKG_TYPE: 0402; ROHS: ROHS
R58 R61 R172 = RES_STANDARD.1: PART_SPEC: RESISTOR; LEVEL: STD; PRT_NUM: 7000282; POWER: 1/16W; TOLERANCE: 5%; PKG_TYPE: 0402; ROHS: ROHS
R59 = RES_STANDARD.1: PART_SPEC: RESISTOR; LEVEL: STD; TOLERANCE: 5%; POWER: 1/16W; PRT_NUM: 7000282; PKG_TYPE: 0402; ROHS: ROHS
SW8 = SW_DIP6.1: PART_SPEC: SWITCH; LEVEL: STD; PRT_NUM: 6000131; PKG_TYPE: SWT017; ROHS: ROHS
TP1-TP8 = MSC_TEST_POINT.2: TESTPOINT; CLASS: DNP; LEVEL: STD; PART_SPEC: TESTPOINT; PART: TESTPOINT; ROHS: ROHS; PKG_TYPE: TP
U11 = ICS_AD1980.1: AC’97 CODEC; LEVEL: STD; PRT_NUM: 30-025762-01; PKG_TYPE: LQFP48; WEB: http://www.analog.com/en/prod/0%2C2877%2CAD1980%2C00.html; ROHS: ROHS
W1 = MSC_COPPER.1: LEVEL: STD; CLASS: DNP; PKG_TYPE: 1A
Y1 = OSC_CRYSTAL.1: CRYSTAL; LEVEL: STD; PRT_NUM: 1000118; PART_SPEC: CRYSTAL; PKG_TYPE: OSC005; ROHS: ROHS

## Sheet a0206-2006.8.SchDoc
size 558 x 431 mm
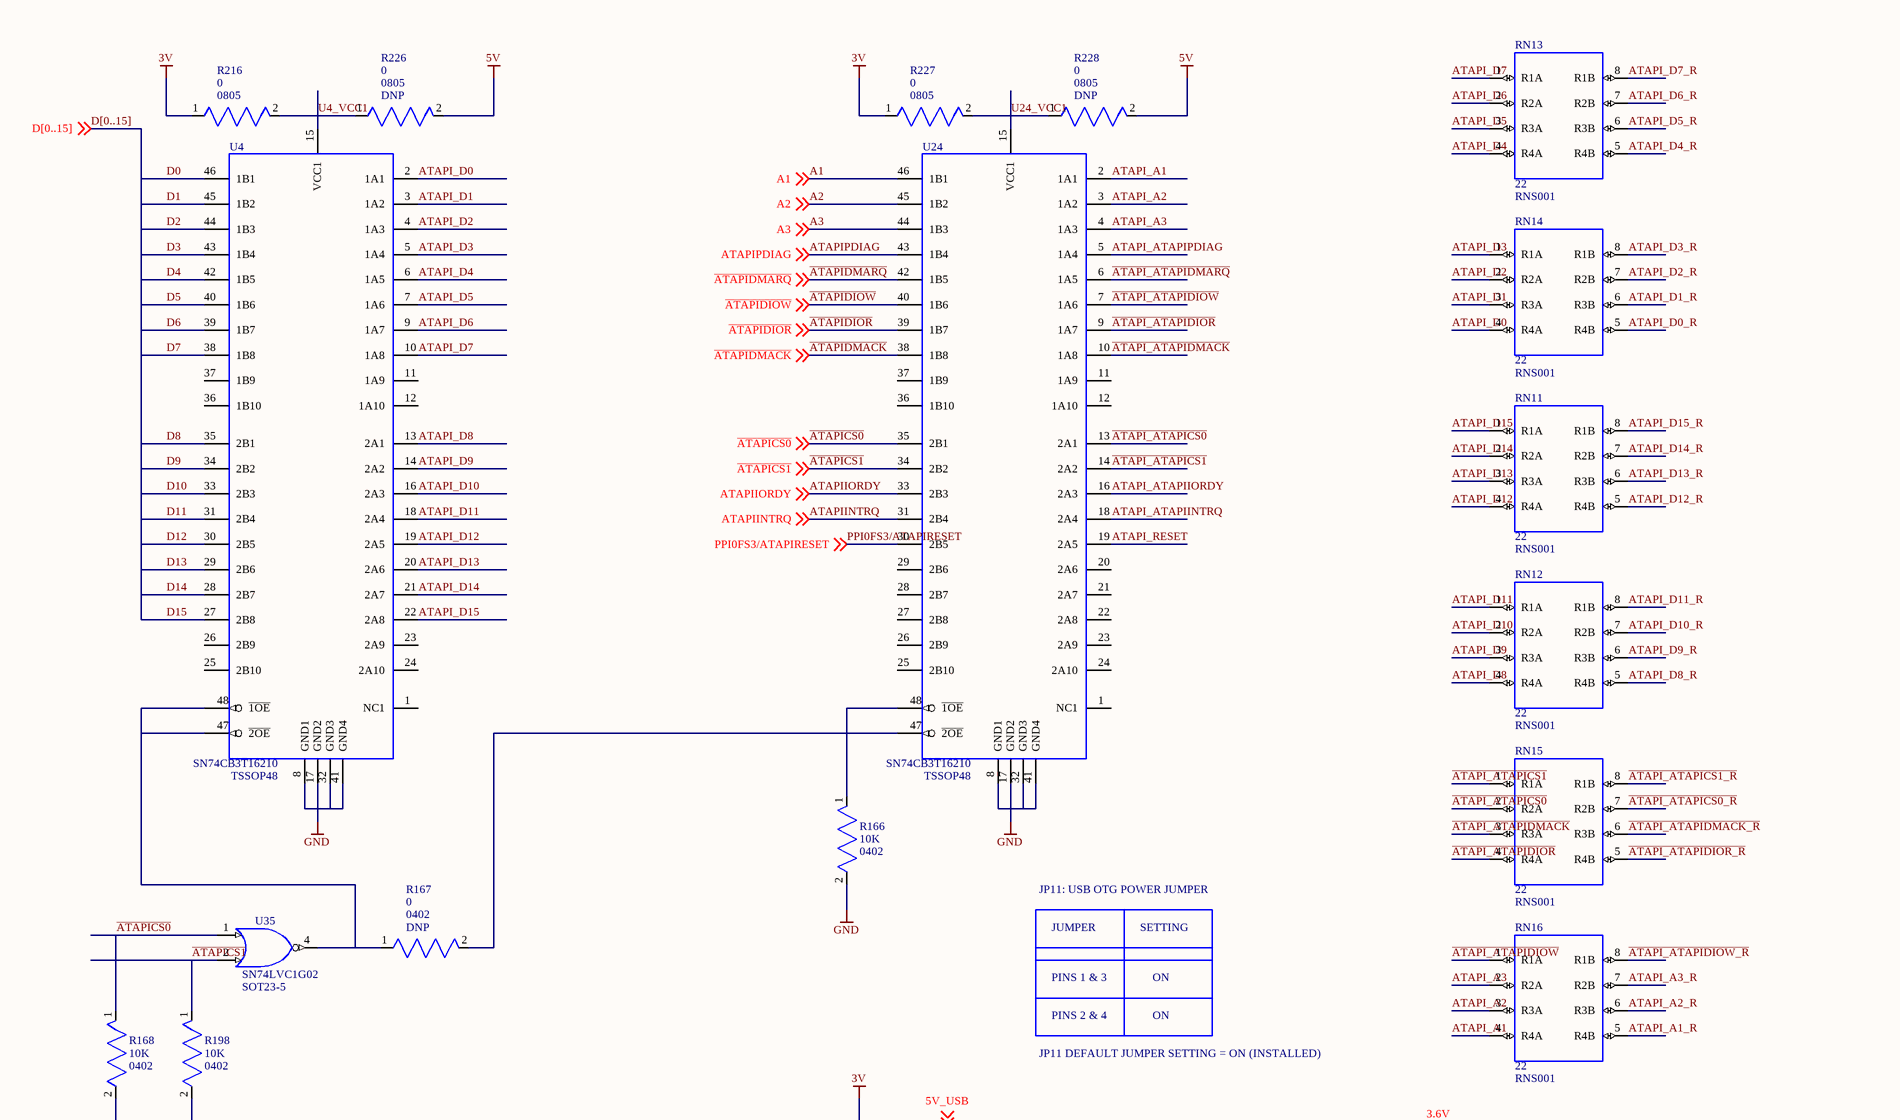
[diagram p23: a0206-2006.8.SchDoc, top left]
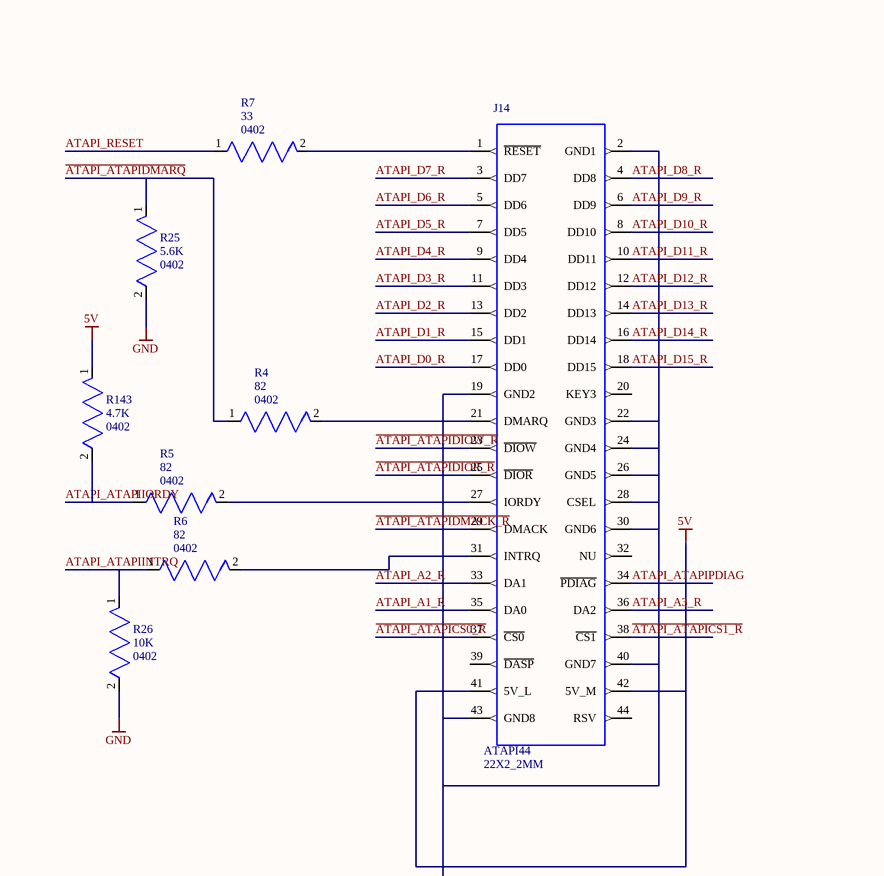
[diagram p24: a0206-2006.8.SchDoc, top right]
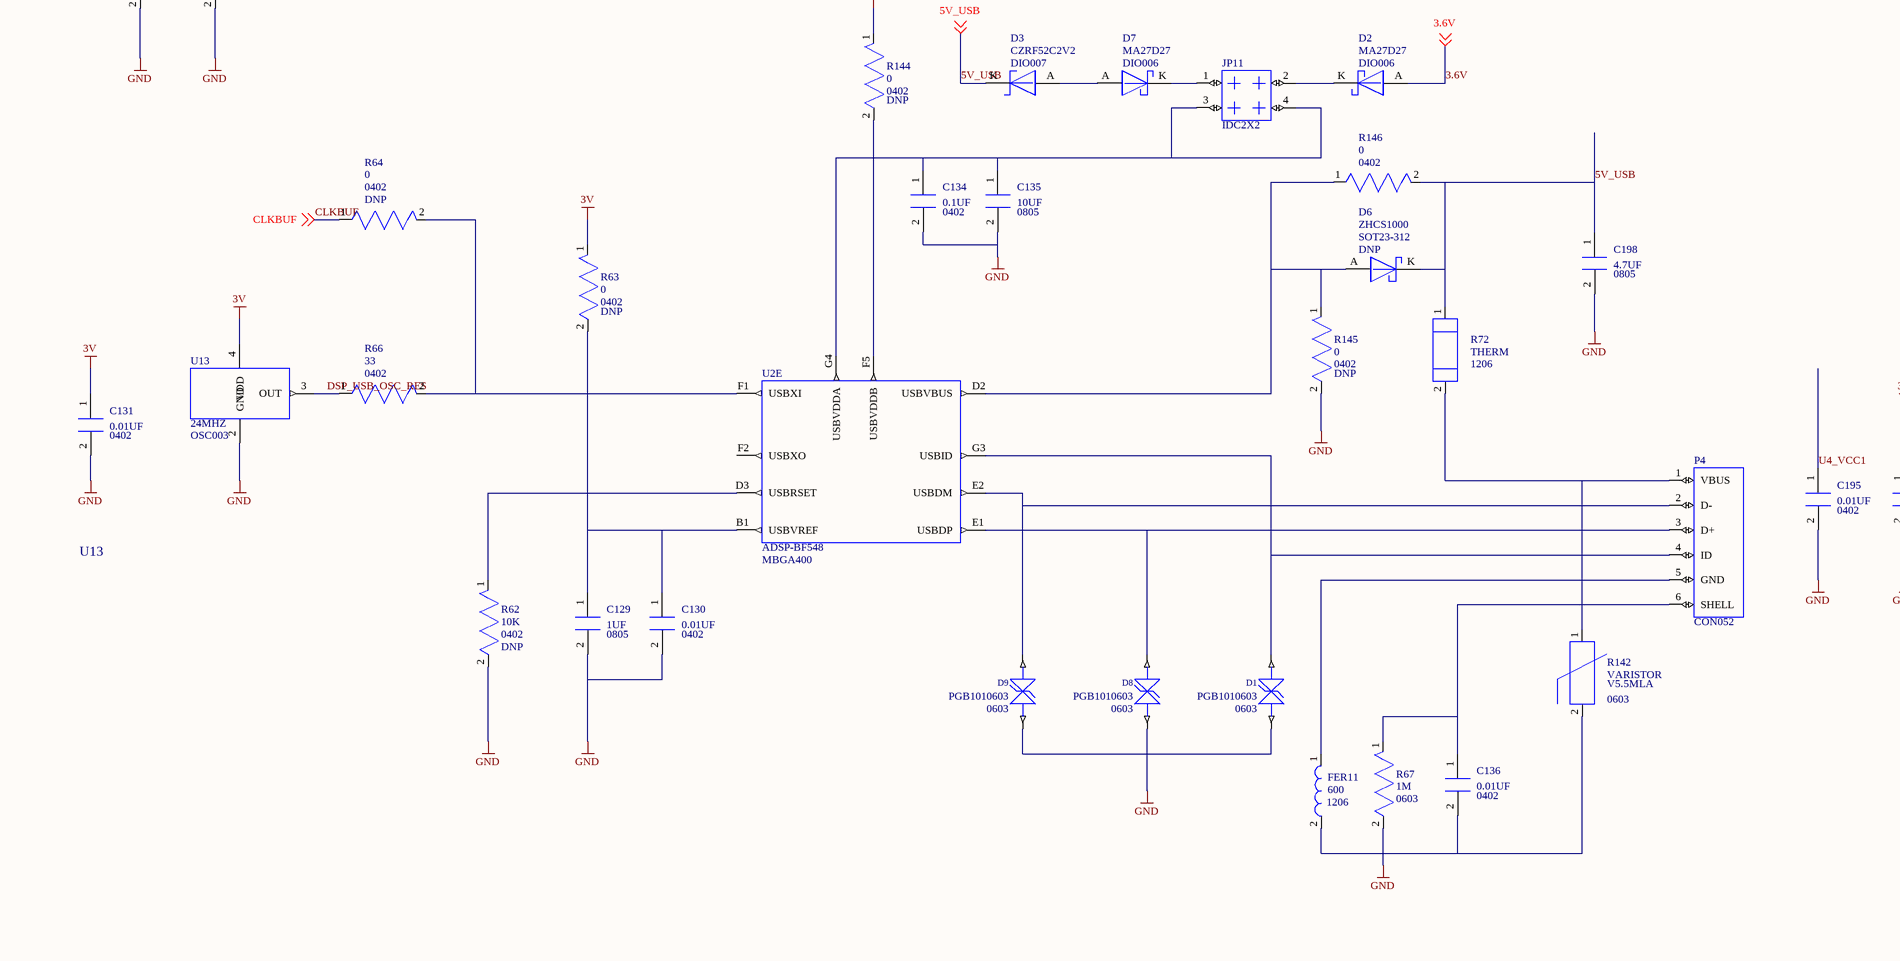
[diagram p25: a0206-2006.8.SchDoc, bottom left]
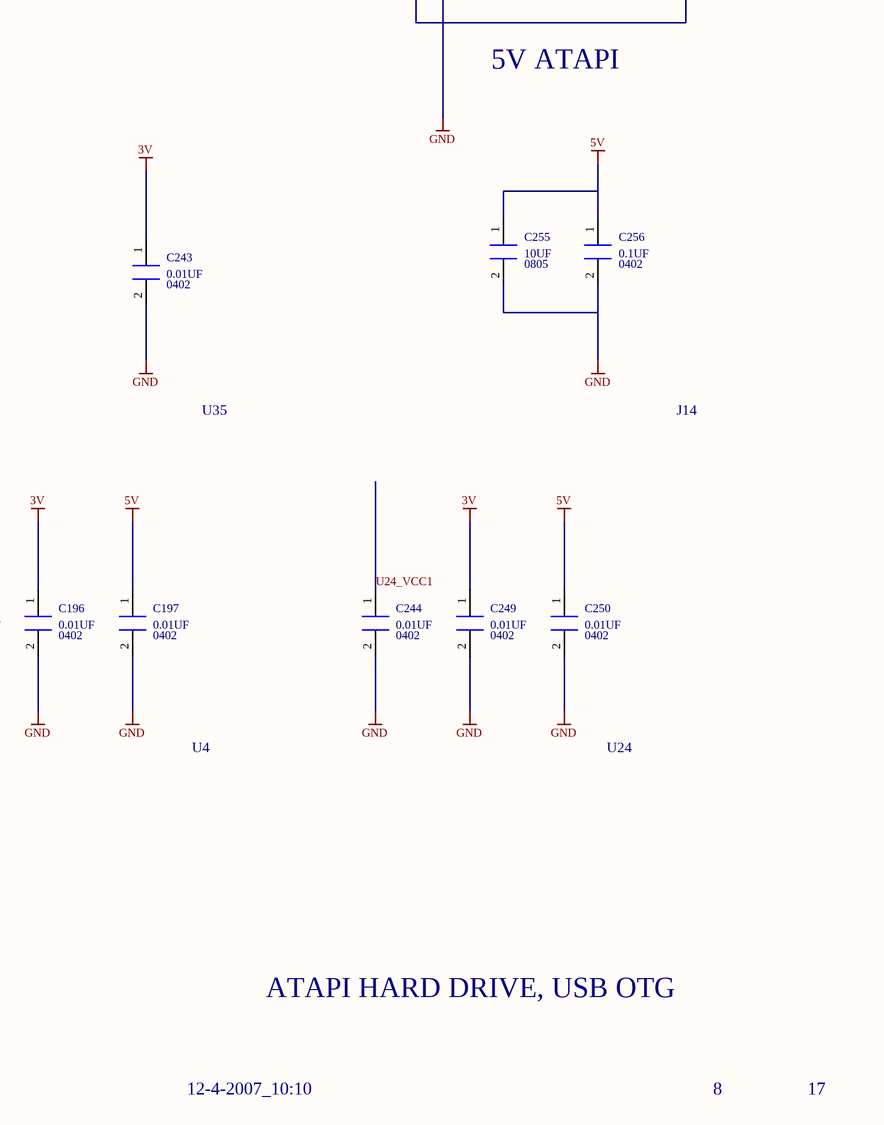
[diagram p26: a0206-2006.8.SchDoc, bottom right]

### Parts
C129  value 1UF  [0805]  (hidden comment: *)
C130  value 0.01UF  [0402]  (hidden comment: *)
C131  value 0.01UF  [0402]  (hidden comment: *)
C134  value 0.1UF  [0402]  (hidden comment: *)
C135  value 10UF  [0805]  (hidden comment: *)
C136  value 0.01UF  [0402]  (hidden comment: *)
C195  value 0.01UF  [0402]  (hidden comment: *)
C196  value 0.01UF  [0402]  (hidden comment: *)
C197  value 0.01UF  [0402]  (hidden comment: *)
C198  value 4.7UF  [0805]  (hidden comment: *)
C243  value 0.01UF  [0402]  (hidden comment: *)
C244  value 0.01UF  [0402]  (hidden comment: *)
C249  value 0.01UF  [0402]  (hidden comment: *)
C250  value 0.01UF  [0402]  (hidden comment: *)
C255  value 10UF  [0805]  (hidden comment: *)
C256  value 0.1UF  [0402]  (hidden comment: *)
D1  PART: PGB1010603  [0603]  (hidden comment: *)
D2  PART: MA27D27  [DIO006]  (hidden comment: *)
D3  PART: CZRF52C2V2  [DIO007]  (hidden comment: *)
D6  PART: ZHCS1000  CLASS: DNP  [SOT23-312]  (hidden comment: *)
D7  PART: MA27D27  [DIO006]  (hidden comment: *)
D8  PART: PGB1010603  [0603]  (hidden comment: *)
D9  PART: PGB1010603  [0603]  (hidden comment: *)
FER11  value 600  [1206]  (hidden comment: *)
J14  ATAPI44  [22X2_2MM]
JP11  *  [IDC2X2]  (value not drawn)
P4  *  [CON052]  (value not drawn)
R4  value 82  [0402]  (hidden comment: *)
R5  value 82  [0402]  (hidden comment: *)
R6  value 82  [0402]  (hidden comment: *)
R7  value 33  [0402]  (hidden comment: *)
R25  value 5.6K  [0402]  (hidden comment: *)
R26  value 10K  [0402]  (hidden comment: *)
R62  value 10K  CLASS: DNP  [0402]  (hidden comment: *)
R63  value 0  CLASS: DNP  [0402]  (hidden comment: *)
R64  value 0  CLASS: DNP  [0402]  (hidden comment: *)
R66  value 33  [0402]  (hidden comment: *)
R67  value 1M  [0603]  (hidden comment: *)
R72  value THERM  [1206]  (hidden comment: *)
R142  value VARISTOR  POWER: V5.5MLA  [0603]  (hidden comment: *)
R143  value 4.7K  [0402]  (hidden comment: *)
R144  value 0  CLASS: DNP  [0402]  (hidden comment: *)
R145  value 0  CLASS: DNP  [0402]  (hidden comment: *)
R146  value 0  [0402]  (hidden comment: *)
R166  value 10K  [0402]  (hidden comment: *)
R167  value 0  CLASS: DNP  [0402]  (hidden comment: *)
R168  value 10K  [0402]  (hidden comment: *)
R198  value 10K  [0402]  (hidden comment: *)
R216  value 0  [0805]  (hidden comment: *)
R226  value 0  CLASS: DNP  [0805]  (hidden comment: *)
R227  value 0  [0805]  (hidden comment: *)
R228  value 0  CLASS: DNP  [0805]  (hidden comment: *)
RN11  value 22  [RNS001]  (hidden comment: *)
RN12  value 22  [RNS001]  (hidden comment: *)
RN13  value 22  [RNS001]  (hidden comment: *)
RN14  value 22  [RNS001]  (hidden comment: *)
RN15  value 22  [RNS001]  (hidden comment: *)
RN16  value 22  [RNS001]  (hidden comment: *)
U2  PART: ADSP-BF548  PKG_TYPE: MBGA400  (hidden comment: ICS_ADSPBF548)  (part E of 7)
U4  PART: SN74CB3T16210  [TSSOP48]  (hidden comment: *)
U13  value 24MHZ  [OSC003]  (hidden comment: *)
U24  PART: SN74CB3T16210  [TSSOP48]  (hidden comment: *)
U35  PART: SN74LVC1G02  [SOT23-5]  (hidden comment: *)

### Nets
3V: C131.1(A) C196.1(A) C243.1(A) C249.1(A) R63.1(N1) R144.1(N1) R216.1(N1) R227.1(N1) U13.4(VDD) U35.5(3V)
5V: C197.1(A) C250.1(A) C255.1(A) C256.1(A) J14.41(5V_L) J14.42(5V_M) R143.1(N1) R226.2(N2) R228.2(N2)
GND: C129.2(B) C130.2(B) C131.2(B) C134.2(B) C135.2(B) C136.2(B) C195.2(B) C196.2(B) C197.2(B) C198.2(B) C243.2(B) C244.2(B) C249.2(B) C250.2(B) C255.2(B) C256.2(B) D1.1(ANODE) D8.1(ANODE) D9.1(ANODE) FER11.2(B) J14.2(GND1) J14.19(GND2) J14.22(GND3) J14.24(GND4) J14.26(GND5) J14.28(CSEL) J14.30(GND6) J14.40(GND7) J14.43(GND8) R25.2(N2) R26.2(N2) R62.2(N2) R67.2(N2) R142.2(N2) R145.2(N2) R166.2(N2) R168.2(N2) R198.2(N2) U4.8(GND1) U4.17(GND2) U4.32(GND3) U4.41(GND4) U13.2(GND) U24.8(GND1) U24.17(GND2) U24.32(GND3) U24.41(GND4) U35.3(GND)
USB_SHELL: P4.7(USB_SHELL) P4.8(USB_SHELL) P4.9(USB_SHELL)
3.6V: D2.A(ANODE) ; off-sheet 3.6V
5V_USB: C198.1(A) D3.K(CATHODE) D6.K(CATHODE) R72.1(N1) R146.2(N2) ; off-sheet 5V_USB
A1: U24.46(1B1) ; off-sheet A1
A2: U24.45(1B2) ; off-sheet A2
A3: U24.44(1B3) ; off-sheet A3
~{ATAPI_ATAPICS0}: RN15.2(R2A) U24.13(2A1)
~{ATAPI_ATAPICS0_R}: J14.37(~{CS0}) RN15.7(R2B)
~{ATAPI_ATAPICS1}: RN15.1(R1A) U24.14(2A2)
~{ATAPI_ATAPICS1_R}: J14.38(~{CS1}) RN15.8(R1B)
~{ATAPI_ATAPIDIOR}: RN15.4(R4A) U24.9(1A7)
~{ATAPI_ATAPIDIOR_R}: J14.25(~{DIOR}) RN15.5(R4B)
~{ATAPI_ATAPIDIOW}: RN16.1(R1A) U24.7(1A6)
~{ATAPI_ATAPIDIOW_R}: J14.23(~{DIOW}) RN16.8(R1B)
~{ATAPI_ATAPIDMACK}: RN15.3(R3A) U24.10(1A8)
~{ATAPI_ATAPIDMACK_R}: J14.29(DMACK) RN15.6(R3B)
~{ATAPI_ATAPIDMARQ}: R4.1(N1) R25.1(N1) U24.6(1A5)
~{ATAPICS0}: R168.1(N1) U24.35(2B1) U35.1(A) ; off-sheet ~{ATAPICS0}
~{ATAPICS1}: R198.1(N1) U24.34(2B2) U35.2(B) ; off-sheet ~{ATAPICS1}
~{ATAPIDIOR}: U24.39(1B7) ; off-sheet ~{ATAPIDIOR}
~{ATAPIDIOW}: U24.40(1B6) ; off-sheet ~{ATAPIDIOW}
~{ATAPIDMACK}: U24.38(1B8) ; off-sheet ~{ATAPIDMACK}
~{ATAPIDMARQ}: U24.42(1B5) ; off-sheet ~{ATAPIDMARQ}
ATAPI_A1: RN16.4(R4A) U24.2(1A1)
ATAPI_A1_R: J14.35(DA0) RN16.5(R4B)
ATAPI_A2: RN16.3(R3A) U24.3(1A2)
ATAPI_A2_R: J14.33(DA1) RN16.6(R3B)
ATAPI_A3: RN16.2(R2A) U24.4(1A3)
ATAPI_A3_R: J14.36(DA2) RN16.7(R2B)
ATAPI_ATAPIINTRQ: R6.1(N1) R26.1(N1) U24.18(2A4)
ATAPI_ATAPIIORDY: R5.1(N1) R143.2(N2) U24.16(2A3)
ATAPI_ATAPIPDIAG: J14.34(~{PDIAG}) U24.5(1A4)
ATAPI_D0: RN14.4(R4A) U4.2(1A1)
ATAPI_D0_R: J14.17(DD0) RN14.5(R4B)
ATAPI_D1: RN14.3(R3A) U4.3(1A2)
ATAPI_D1_R: J14.15(DD1) RN14.6(R3B)
ATAPI_D2: RN14.2(R2A) U4.4(1A3)
ATAPI_D2_R: J14.13(DD2) RN14.7(R2B)
ATAPI_D3: RN14.1(R1A) U4.5(1A4)
ATAPI_D3_R: J14.11(DD3) RN14.8(R1B)
ATAPI_D4: RN13.4(R4A) U4.6(1A5)
ATAPI_D4_R: J14.9(DD4) RN13.5(R4B)
ATAPI_D5: RN13.3(R3A) U4.7(1A6)
ATAPI_D5_R: J14.7(DD5) RN13.6(R3B)
ATAPI_D6: RN13.2(R2A) U4.9(1A7)
ATAPI_D6_R: J14.5(DD6) RN13.7(R2B)
ATAPI_D7: RN13.1(R1A) U4.10(1A8)
ATAPI_D7_R: J14.3(DD7) RN13.8(R1B)
ATAPI_D8: RN12.4(R4A) U4.13(2A1)
ATAPI_D8_R: J14.4(DD8) RN12.5(R4B)
ATAPI_D9: RN12.3(R3A) U4.14(2A2)
ATAPI_D9_R: J14.6(DD9) RN12.6(R3B)
ATAPI_D10: RN12.2(R2A) U4.16(2A3)
ATAPI_D10_R: J14.8(DD10) RN12.7(R2B)
ATAPI_D11: RN12.1(R1A) U4.18(2A4)
ATAPI_D11_R: J14.10(DD11) RN12.8(R1B)
ATAPI_D12: RN11.4(R4A) U4.19(2A5)
ATAPI_D12_R: J14.12(DD12) RN11.5(R4B)
ATAPI_D13: RN11.3(R3A) U4.20(2A6)
ATAPI_D13_R: J14.14(DD13) RN11.6(R3B)
ATAPI_D14: RN11.2(R2A) U4.21(2A7)
ATAPI_D14_R: J14.16(DD14) RN11.7(R2B)
ATAPI_D15: RN11.1(R1A) U4.22(2A8)
ATAPI_D15_R: J14.18(DD15) RN11.8(R1B)
ATAPI_RESET: R7.1(N1) U24.19(2A5)
ATAPIINTRQ: U24.31(2B4) ; off-sheet ATAPIINTRQ
ATAPIIORDY: U24.33(2B3) ; off-sheet ATAPIIORDY
ATAPIPDIAG: U24.43(1B4) ; off-sheet ATAPIPDIAG
CLKBUF: R64.1(N1) ; off-sheet CLKBUF
D0: U4.46(1B1)
D1: U4.45(1B2)
D2: U4.44(1B3)
D3: U4.43(1B4)
D4: U4.42(1B5)
D5: U4.40(1B6)
D6: U4.39(1B7)
D7: U4.38(1B8)
D8: U4.35(2B1)
D9: U4.34(2B2)
D10: U4.33(2B3)
D11: U4.31(2B4)
D12: U4.30(2B5)
D13: U4.29(2B6)
D14: U4.28(2B7)
D15: U4.27(2B8)
DSP_USB_OSC_RES: R66.1(N1) U13.3(OUT)
PPI0FS3/ATAPIRESET: U24.30(2B5) ; off-sheet PPI0FS3/ATAPIRESET
U4_VCC1: C195.1(A) R216.2(N2) R226.1(N1) U4.15(VCC1)
U24_VCC1: C244.1(A) R227.2(N2) R228.1(N1) U24.15(VCC1)
NetC129_1: C129.1(A) C130.1(A) R63.2(N2) U2.B1(USBVREF)
NetC134_1: C134.1(A) C135.1(A) JP11.3 JP11.4 R144.2(N2) U2.F5(USBVDDB) U2.G4(USBVDDA)
NetC136_1: C136.1(A) P4.6(SHELL) R67.1(N1)
NetD1_2: D1.2(CATHODE) P4.4(ID) U2.G3(USBID)
NetD2_K: D2.K(CATHODE) JP11.2
NetD3_A: D3.A(ANODE) D7.A(ANODE)
NetD6_A: D6.A(ANODE) R145.1(N1) R146.1(N1) U2.D2(USBVBUS)
NetD7_K: D7.K(CATHODE) JP11.1
NetD8_2: D8.2(CATHODE) P4.3(D+) U2.E1(USBDP)
NetD9_2: D9.2(CATHODE) P4.2(D-) U2.E2(USBDM)
NetFER11_1: FER11.1(A) P4.5(GND)
NetJ14_1: J14.1(~{RESET}) R7.2(N2)
NetJ14_21: J14.21(DMARQ) R4.2(N2)
NetJ14_27: J14.27(IORDY) R5.2(N2)
NetJ14_31: J14.31(INTRQ) R6.2(N2)
NetP4_1: P4.1(VBUS) R72.2(N2) R142.1(N1)
NetR62_1: R62.1(N1) U2.D3(USBRSET)
NetR64_2: R64.2(N2) R66.2(N2) U2.F1(USBXI)
NetR166_1: R166.1(N1) R167.2(N2) U24.47(~{2OE}) U24.48(~{1OE})
NetR167_1: R167.1(N1) U4.47(~{2OE}) U4.48(~{1OE}) U35.4(Y)

Not connected (* = marked no-connect by the designer): J14 20(KEY3) 32(NU) 39(~{DASP}) 44(RSV); U2 F2(USBXO); U4 1(NC1) 11(1A9) 12(1A10) 23(2A9) 24(2A10) 25(2B10) 26(2B9) 36(1B10) 37(1B9); U13 1; U24 1(NC1) 11(1A9) 12(1A10) 20(2A6) 21(2A7) 22(2A8) 23(2A9) 24(2A10) 25(2B10) 26(2B9) 27(2B8) 28(2B7) 29(2B6) 36(1B10) 37(1B9)

### Buses and harness runs
bus D[0..15]

### Notes on the sheet
- JP11: USB OTG POWER JUMPER
- PINS 1 & 3
- JUMPER
- SETTING
- ON
- PINS 2 & 4
- JP11 DEFAULT JUMPER SETTING = ON (INSTALLED)
- 5V ATAPI
- U35
- J14
- U13
- U4
- U24
- ATAPI HARD DRIVE, USB OTG
- 12-4-2007_10:10
- 8
- 17
- A
- B
- C
- D
- 1
- 2
- 3
- 20 Cotton Road
- 4
- DEVICES
- ANALOG
- Nashua, NH 03063
- PH: 1-800-ANALOGD
- Title
- ADSP-BF548 EZ-KIT LITE
- Size
- Board No.
- A0206-2006
- Rev
- 1.4B
- Date
- Sheet
- of

### Library data of the parts
C129 = CAP_NON_POLARIZED.2: PART_SPEC: CAPACITOR; LEVEL: STD; TOLERANCE: 10%; VOLTAGE: 16V; TYPE: X7R; PRT_NUM: 7000143; PKG_TYPE: 0805; ROHS: ROHS
C130 C136 = CAP_NON_POLARIZED.2: as C112 on sheet a0206-2006.7; PKG_TYPE: 0402; ROHS: ROHS
C131 C195 C197 C243 C249 = CAP_NON_POLARIZED.2: PART_SPEC: CAPACITOR; LEVEL: STD; TYPE: X7R; BOARDS: BOTH; TOLERANCE: 10%; VOLTAGE: 16V; PRT_NUM: 7000279; PKG_TYPE: 0402; ROHS: ROHS
C134 = CAP_NON_POLARIZED.2: as C96 on sheet a0206-2006.7; PKG_TYPE: 0402; ROHS: ROHS
C135 = CAP_NON_POLARIZED.2: PART_SPEC: CAPACITOR; LEVEL: STD; PRT_NUM: 7000461; TYPE: X5R CER; VOLTAGE: 10V; TOLERANCE: 10%; PKG_TYPE: 0805; ROHS: ROHS
C196 C244 C250 = CAP_NON_POLARIZED.2: PART_SPEC: CAPACITOR; LEVEL: STD; PRT_NUM: 7000279; VOLTAGE: 16V; TOLERANCE: 10%; BOARDS: BOTH; TYPE: X7R; PKG_TYPE: 0402; ROHS: ROHS
C198 = CAP_NON_POLARIZED.2: PART_SPEC: CAPACITOR; LEVEL: STD; TOLERANCE: 10%; VOLTAGE: 6.3V; TYPE: X5R; PRT_NUM: 7000275; PKG_TYPE: 0805; ROHS: ROHS
C255 = CAP_NON_POLARIZED.2: as C122 on sheet a0206-2006.7; PKG_TYPE: 0805; ROHS: ROHS
C256 = CAP_NON_POLARIZED.2: as C119 on sheet a0206-2006.7; PKG_TYPE: 0402; ROHS: ROHS
D1 D8 D9 = DIO_SUPRESSOR.1: ESD SUPPRESSOR; LEVEL: STD; CURRENT: 15KV; PRT_NUM: 7000555; PKG_TYPE: 0603; ROHS: ROHS; WEB: http://www.littelfuse.com/cgi-bin/r.cgi/en/prod_parts.html?PartID
D2 = DIO_SCHOTTKY.2: SCHOTTKY BARRIER; LEVEL: STD; CURRENT: 100MA; PRT_NUM: 7000560; PKG_TYPE: DIO006; WEB: http://www.semicon.panasonic.co.jp/ds/eng/SKH00122AED.pdf; ROHS: ROHS
D3 = DIO_ZENER2P.1: ZENER; LEVEL: STD; CURRENT: 2A; PRT_NUM: 7000562; PKG_TYPE: DIO007; ROHS: ROHS; WEB: http://www.comchiptech.com/docs/CZRF52series.pdf
D6 = DIO_SCHOTTKY_3.3: SCHOTTKY; LEVEL: STD; CURRENT: 1A; PRT_NUM: 7000252; PKG_TYPE: SOT23-312; WEB: http://www.zetex.com/3.0/3-3-3.asp?pn; ROHS: ROHS
D7 = DIO_SCHOTTKY.1: SCHOTTKY BARRIER; LEVEL: STD; CURRENT: 100MA; PRT_NUM: 7000560; PKG_TYPE: DIO006; WEB: http://www.semicon.panasonic.co.jp/ds/eng/SKH00122AED.pdf; ROHS: ROHS
FER11 = FER_STANDARD.2: PART_SPEC: FERRITE; LEVEL: STD; CURRENT: 500MA; FREQ: 100MHZ; PRT_NUM: 7000117; PKG_TYPE: 1206; ROHS: ROHS
J14 = CON_ATAPI_44.1: SOCKET RA; LEVEL: STD; PRT_NUM: 6000831; CONFIGURATION: 44PIN; DEVICE: ATAPI44; PKG_TYPE: 22X2_2MM; TYPE: ATAPI44; ROHS: ROHS
JP11 = CON_JP_2X2.1: HEADER; PART_SPEC: CONNECTOR; LEVEL: STD; PRT_NUM: 6000797; CONFIGURATION: 2X2; PKG_TYPE: IDC2X2; TYPE: IDC; ROHS: ROHS
P4 = CON_USB_MINI_AB.1: USB OTG CONN; PART_SPEC: CONNECTOR; LEVEL: STD; CONFIGURATION: 5PIN; PRT_NUM: 6000828; PKG_TYPE: CON052; ROHS: ROHS; TYPE: USB_MINI-AB
R4 R6 = RES_STANDARD.1: PART_SPEC: RESISTOR; LEVEL: STD; PRT_NUM: 7000573; TOLERANCE: 5%; POWER: 1/16W; PKG_TYPE: 0402; ROHS: ROHS
R5 = RES_STANDARD.1: PART_SPEC: RESISTOR; LEVEL: STD; PRT_NUM: 7000573; POWER: 1/16W; TOLERANCE: 5%; PKG_TYPE: 0402; ROHS: ROHS
R7 = RES_STANDARD.1: PART_SPEC: RESISTOR; LEVEL: STD; PRT_NUM: 7000285; POWER: 1/16W; TOLERANCE: 5%; PKG_TYPE: 0402; ROHS: ROHS
R25 = RES_STANDARD.2: PART_SPEC: RESISTOR; LEVEL: STD; PRT_NUM: 7000569; TOLERANCE: 5%; BOARDS: BOTH; POWER: 1/16W; PKG_TYPE: 0402; ROHS: ROHS
R26 R168 = RES_STANDARD.2: PART_SPEC: RESISTOR; LEVEL: STD; POWER: 1/16W; BOARDS: BOTH; TOLERANCE: 5%; PRT_NUM: 7000280; PKG_TYPE: 0402; ROHS: ROHS
R62 R166 R198 = RES_STANDARD.2: PART_SPEC: RESISTOR; LEVEL: STD; PRT_NUM: 7000280; TOLERANCE: 5%; BOARDS: BOTH; POWER: 1/16W; PKG_TYPE: 0402; ROHS: ROHS
R63 R144 R145 = RES_STANDARD.2: PART_SPEC: RESISTOR; LEVEL: STD; TOLERANCE: 5%; POWER: 1/16W; PRT_NUM: 7000282; PKG_TYPE: 0402; ROHS: ROHS
R64 = RES_STANDARD.1: as R59 on sheet a0206-2006.7; PKG_TYPE: 0402; ROHS: ROHS
R66 = RES_STANDARD.1: PART_SPEC: RESISTOR; LEVEL: STD; POWER: 1/16W; BOARDS: BOTH; TOLERANCE: 5%; PRT_NUM: 7000285; PKG_TYPE: 0402; ROHS: ROHS
R67 = RES_STANDARD.2: PART_SPEC: RESISTOR; LEVEL: STD; TOLERANCE: 5%; POWER: 1/10W; PRT_NUM: 7000369; PKG_TYPE: 0603; ROHS: ROHS
R72 = RES_THERMISTOR.1: PART_SPEC: RESISTOR; LEVEL: STD; POWER: 0.5A; TOLERANCE: 0.4; PRT_NUM: 7000557; PKG_TYPE: 1206; ROHS: ROHS
R142 = RES_VARISTOR.1: PART_SPEC: RESISTOR; LEVEL: STD; TOLERANCE: 30A; PRT_NUM: 7000556; PKG_TYPE: 0603; ROHS: ROHS
R143 = RES_STANDARD.2: PART_SPEC: RESISTOR; LEVEL: STD; PRT_NUM: 7000281; TOLERANCE: 5%; BOARDS: BOTH; POWER: 1/16W; PKG_TYPE: 0402; ROHS: ROHS
R146 = RES_STANDARD.1: PART_SPEC: RESISTOR; LEVEL: STD; POWER: 1/16W; BOARDS: BOTH; TOLERANCE: 5%; PRT_NUM: 7000282; PKG_TYPE: 0402; ROHS: ROHS
R167 = RES_STANDARD.1: as R58 on sheet a0206-2006.7; PKG_TYPE: 0402; ROHS: ROHS
R216 R227 = RES_STANDARD.1: PART_SPEC: RESISTOR; LEVEL: STD; PRT_NUM: 7000228; POWER: 1/10W; TOLERANCE: 5%; PKG_TYPE: 0805; ROHS: ROHS
R226 R228 = RES_STANDARD.1: PART_SPEC: RESISTOR; LEVEL: STD; TOLERANCE: 5%; POWER: 1/10W; PRT_NUM: 7000228; PKG_TYPE: 0805; ROHS: ROHS
RN11-RN13 RN16 = RNET_4SERIES.1: SERIES; PART_SPEC: RESISTOR_NETWORK; LEVEL: STD; PRT_NUM: 7000257; POWER: 125MW; TOLERANCE: 5%; PKG_TYPE: RNS001; ROHS: ROHS
RN14 RN15 = RNET_4SERIES.1: SERIES; PART_SPEC: RESISTOR_NETWORK; LEVEL: STD; TOLERANCE: 5%; POWER: 125MW; PRT_NUM: 7000257; PKG_TYPE: RNS001; ROHS: ROHS
U2 = ICS_ADSPBF548_A: 600 MHZ; LEVEL: STD; PRT_NUM: 30-025548-02; DEVICE: ICS_ADSPBF548; ROHS: ROHS; WEB: http://www.analog.com/en/prod/0,2877,ADSP%252DBF548,00.html
U4 U24 = ICS_SN74CB3T16210.1: 20BIT FET SWT W/LVL SHIFT; LEVEL: STD; PRT_NUM: 1000455; PKG_TYPE: TSSOP48; WEB: http://focus.ti.com/docs/prod/folders/print/sn74cb3t16210.html; ROHS: ROHS
U13 = OSC_SMT.2: OSCILLATOR; NC: 1; LEVEL: STD; PRT_NUM: 1000422; PART_SPEC: OSCILLATOR; PKG_TYPE: OSC003; ROHS: ROHS
U35 = ICS_SN74XXX1G02.1: SINGLE 2-INPUT NOR-LW TPD; LEVEL: STD; PRT_NUM: 1000437; PKG_TYPE: SOT23-5; ROHS: ROHS; WEB: http://focus.ti.com/docs/prod/folders/print/sn74lvc1g02.html